# Altium project PCB-MAIN.PrjPcb (part 3 of 3)

## Sheet PCB-MAIN_06_LORA.SchDoc
size 594 x 420 mm
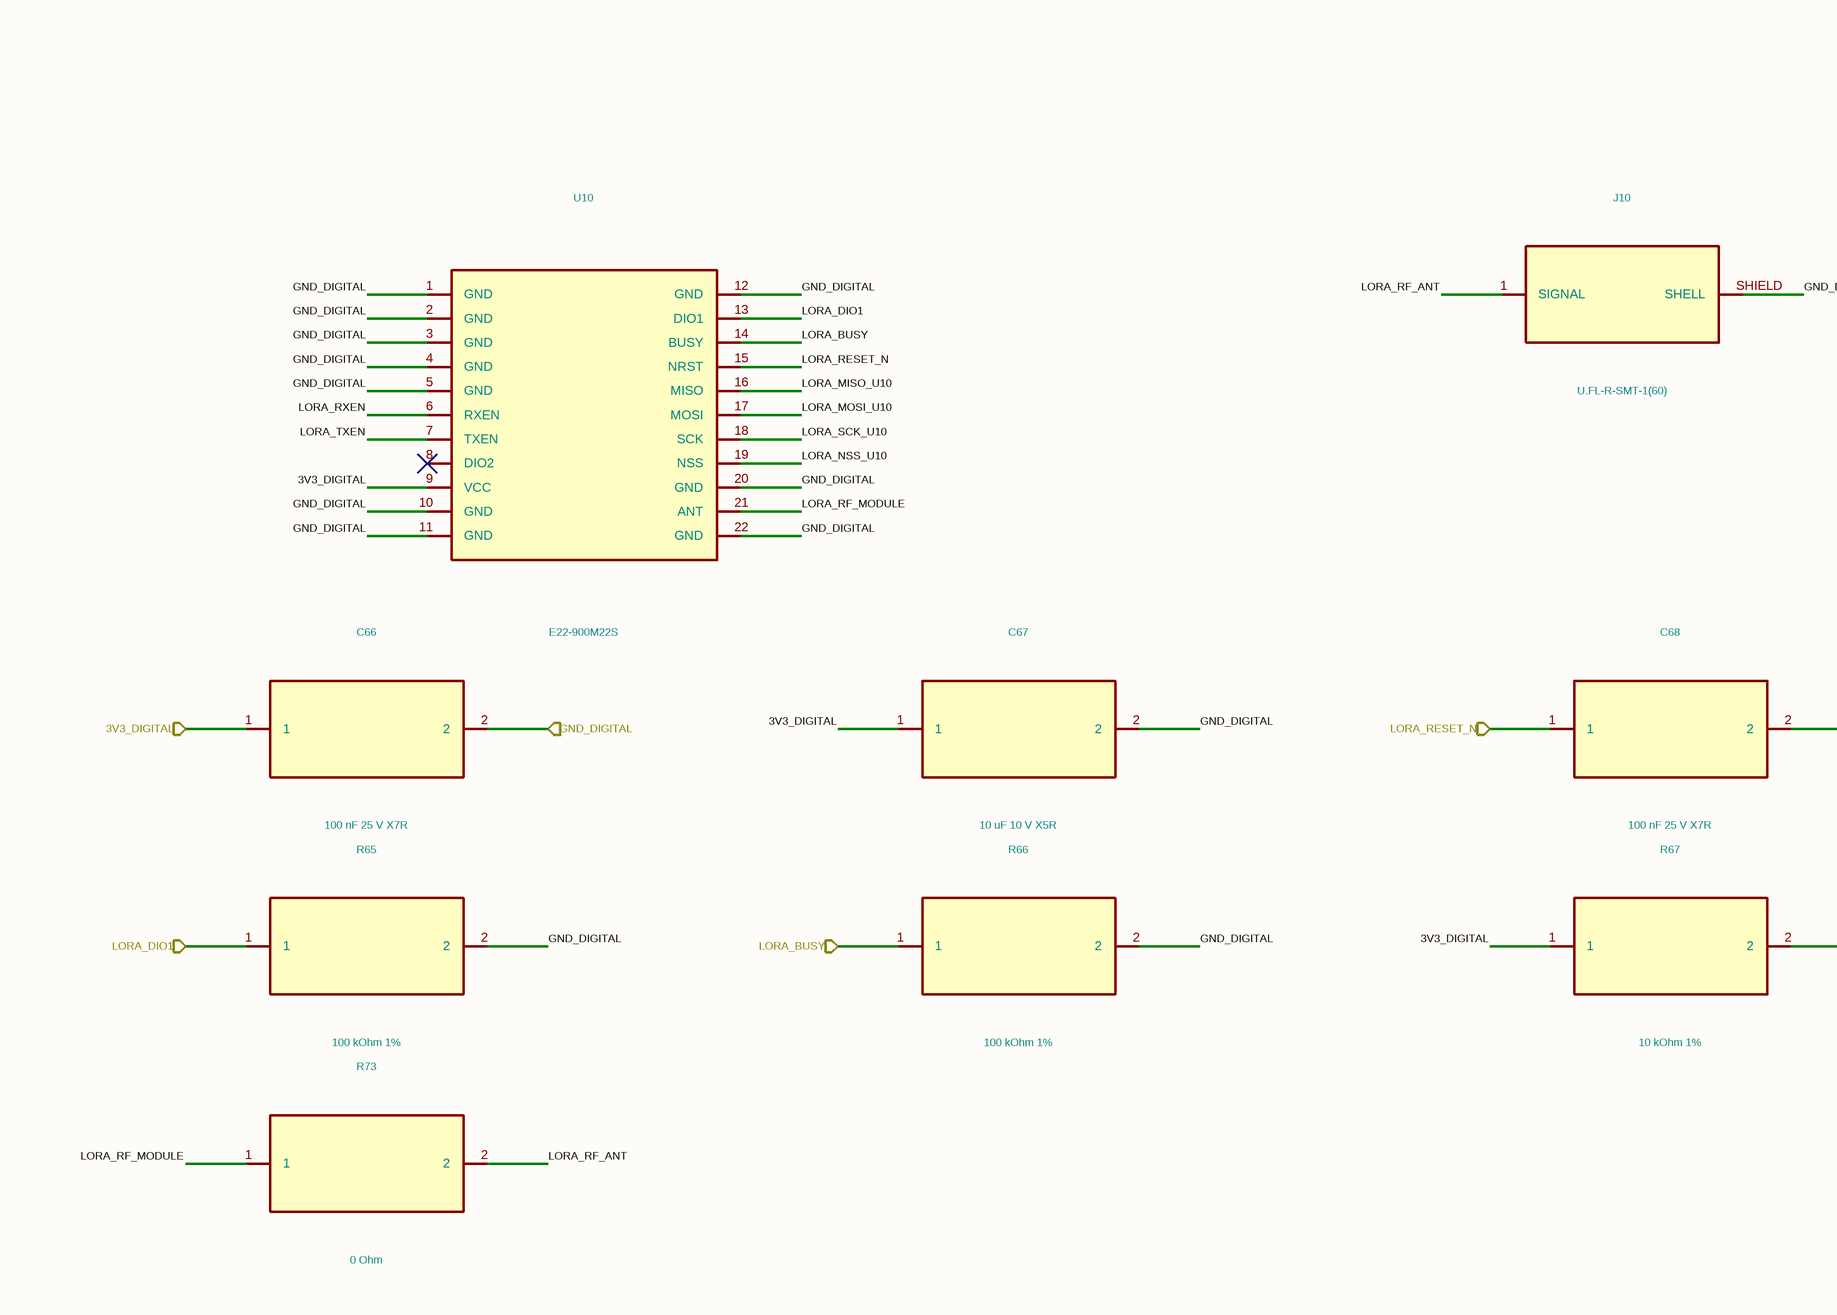
[diagram p41: PCB-MAIN_06_LORA.SchDoc, top left]
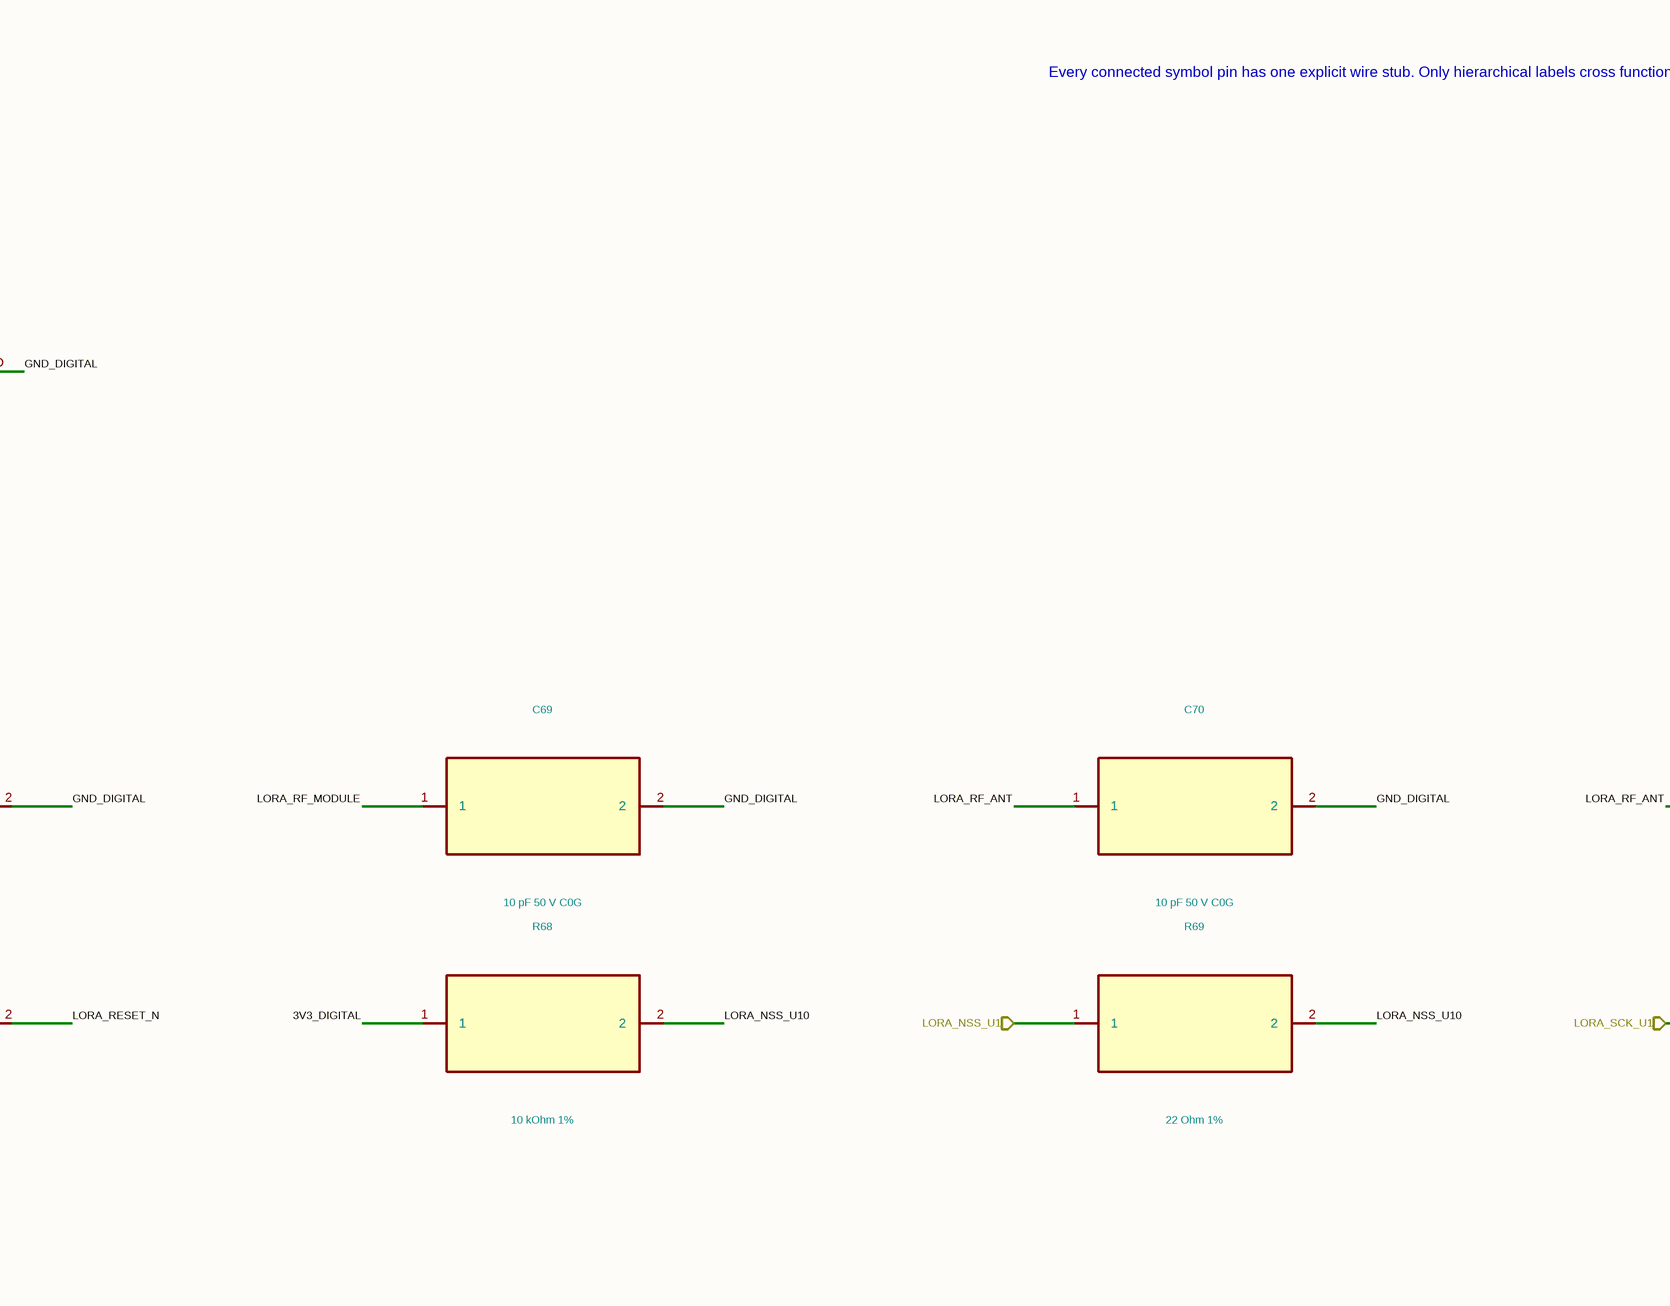
[diagram p42: PCB-MAIN_06_LORA.SchDoc, top middle]
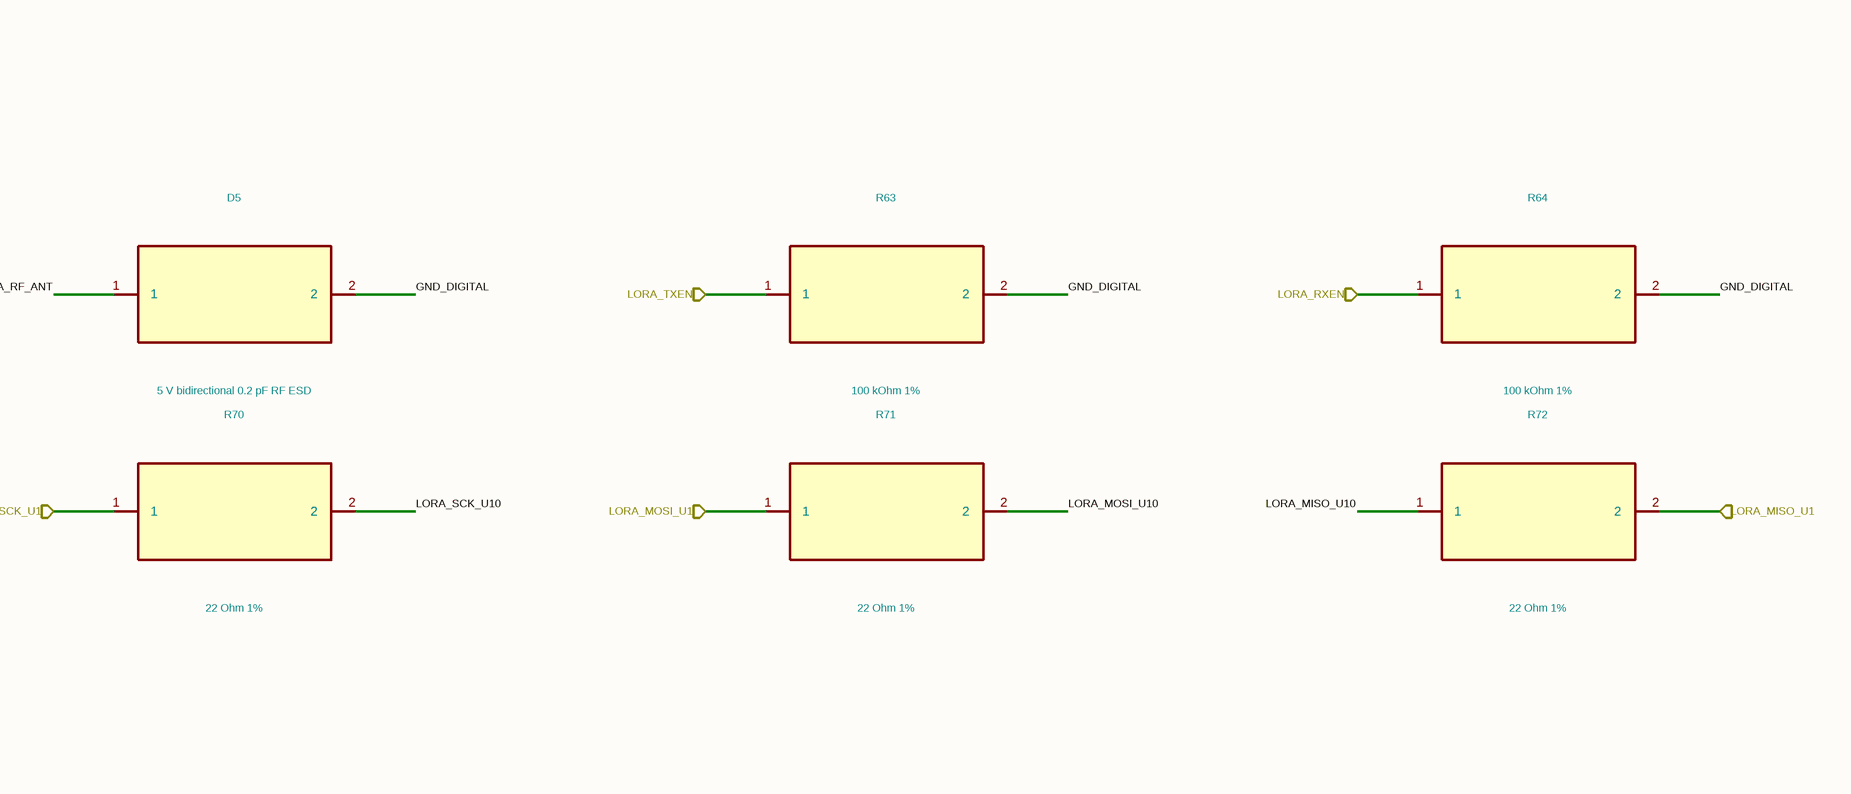
[diagram p43: PCB-MAIN_06_LORA.SchDoc, top right]
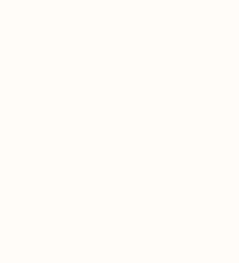
[diagram p44: PCB-MAIN_06_LORA.SchDoc, bottom left]

### Parts
C66  100 nF 25 V X7R  [C_0402_1005Metric]
C67  10 uF 10 V X5R  [C_0603_1608Metric]
C68  100 nF 25 V X7R  [C_0402_1005Metric]
C69  10 pF 50 V C0G  [C_0402_1005Metric]
C70  10 pF 50 V C0G  [C_0402_1005Metric]
D5  5 V bidirectional 0.2 pF RF ESD
J10  U.FL-R-SMT-1(60)
R63  100 kOhm 1%  [R_0402_1005Metric]
R64  100 kOhm 1%  [R_0402_1005Metric]
R65  100 kOhm 1%  [R_0402_1005Metric]
R66  100 kOhm 1%  [R_0402_1005Metric]
R67  10 kOhm 1%  [R_0402_1005Metric]
R68  10 kOhm 1%  [R_0402_1005Metric]
R69  22 Ohm 1%  [R_0402_1005Metric]
R70  22 Ohm 1%  [R_0402_1005Metric]
R71  22 Ohm 1%  [R_0402_1005Metric]
R72  22 Ohm 1%  [R_0402_1005Metric]
R73  0 Ohm  [R_0402_1005Metric]
U10  E22-900M22S

### Ports
3V3_DIGITAL, GND_DIGITAL, LORA_BUSY, LORA_DIO1, LORA_MISO_U1, LORA_MOSI_U1, LORA_NSS_U1, LORA_RESET_N, LORA_RXEN, LORA_SCK_U1, LORA_TXEN

### Nets
3V3_DIGITAL: C66.1 ; port 3V3_DIGITAL
3V3_DIGITAL: C67.1 R67.1 R68.1 U10.9(VCC)  [a separate net that carries the same name]
GND_DIGITAL: C66.2 ; port GND_DIGITAL
GND_DIGITAL: C67.2 C68.2 C69.2 C70.2 D5.2 J10.SHIELD(SHELL) R63.2 R64.2 R65.2 R66.2 U10.1(GND) U10.2(GND) U10.3(GND) U10.4(GND) U10.5(GND) U10.10(GND) U10.11(GND) U10.12(GND) U10.20(GND) U10.22(GND)  [a separate net that carries the same name]
LORA_BUSY: R66.1 ; port LORA_BUSY
LORA_BUSY: U10.14(BUSY)  [a separate net that carries the same name]
LORA_DIO1: R65.1 ; port LORA_DIO1
LORA_DIO1: U10.13(DIO1)  [a separate net that carries the same name]
LORA_MISO_U1: R72.2 ; port LORA_MISO_U1
LORA_MISO_U10: R72.1 U10.16(MISO)
LORA_MOSI_U1: R71.1 ; port LORA_MOSI_U1
LORA_MOSI_U10: R71.2 U10.17(MOSI)
LORA_NSS_U1: R69.1 ; port LORA_NSS_U1
LORA_NSS_U10: R68.2 R69.2 U10.19(NSS)
LORA_RESET_N: C68.1 ; port LORA_RESET_N
LORA_RESET_N: R67.2 U10.15(NRST)  [a separate net that carries the same name]
LORA_RF_ANT: C70.1 D5.1 J10.1(SIGNAL) R73.2
LORA_RF_MODULE: C69.1 R73.1 U10.21(ANT)
LORA_RXEN: R64.1 ; port LORA_RXEN
LORA_RXEN: U10.6(RXEN)  [a separate net that carries the same name]
LORA_SCK_U1: R70.1 ; port LORA_SCK_U1
LORA_SCK_U10: R70.2 U10.18(SCK)
LORA_TXEN: R63.1 ; port LORA_TXEN
LORA_TXEN: U10.7(TXEN)  [a separate net that carries the same name]

Not connected (* = marked no-connect by the designer): U10 8(DIO2)*

### Notes on the sheet
- Every connected symbol pin has one explicit wire stub. Only hierarchical labels cross functional-sheet boundaries.
- 1
- 2
- 3
- 4
- 5
- 6
- 7
- 8
- 9
- 10
- 11
- A
- B
- C
- D
- E
- F
- G
- H
- Human-readable hierarchy candidate; exact Review-A pin/net equivalence enforced
- Functional sheet 7 of 10
- NOT FOR MANUFACTURE - hierarchy review/routing/DRC/DFM/Review B pending
- Title: Dioneya PCB-MAIN Rev.A - LoRa
- File: PCB-MAIN_06_LORA.kicad_sch
- Sheet: /
- Dioneya / ZS-BPLA
- KiCad E.D.A.  kicad (5.1.4)-1
- Size: A2
- Date: 2026-09-16
- Rev: A
- Id: 1/1

### Library data of the parts
C66 = C66_GRM155R71E104KE14D: Manufacturer: Murata; Population: FITTED; Authority: Ebyte_E22-M_v1.2; MPN: GRM155R71E104KE14D; Package: 0402; Value: 100 nF 25 V X7R; Footprint: Capacitor_SMD:C_0402_1005Metric
C67 = C67_GRM188R61A106KE69D: Manufacturer: Murata; Population: FITTED; Authority: Ebyte_E22-M_v1.2; MPN: GRM188R61A106KE69D; Package: 0603; Value: 10 uF 10 V X5R; Footprint: Capacitor_SMD:C_0603_1608Metric
C68 = C68_GRM155R71E104KE14D: Manufacturer: Murata; Population: FITTED; Authority: Ebyte_E22-M_v1.2; MPN: GRM155R71E104KE14D; Package: 0402; Value: 100 nF 25 V X7R; Footprint: Capacitor_SMD:C_0402_1005Metric
C69 = C69_GRM1555C1H100JA01D: Manufacturer: Murata; Population: DNP; Authority: Ebyte_E22-M_v1.2; MPN: GRM1555C1H100JA01D; Package: 0402; Value: 10 pF 50 V C0G; Footprint: Capacitor_SMD:C_0402_1005Metric
C70 = C70_GRM1555C1H100JA01D: Manufacturer: Murata; Population: DNP; Authority: Ebyte_E22-M_v1.2; MPN: GRM1555C1H100JA01D; Package: 0402; Value: 10 pF 50 V C0G; Footprint: Capacitor_SMD:C_0402_1005Metric
D5 = D5_PESD5V0C1BSF: Manufacturer: Nexperia; Population: FITTED; Authority: Nexperia_PESD5V0C1BSF_v3; MPN: PESD5V0C1BSF; Package: SOD962-2; Value: 5 V bidirectional 0.2 pF RF ESD
J10 = J10_U.FL-R-SMT-1_60: Manufacturer: CONTROLLED_AUTHORITY; Population: FITTED; Authority: PCB_MAIN_LORA_PIN_AUTHORITY_REV_A.csv;PCB_MAIN_CONNECTOR_FIXTURE_PIN_AUTHORITY_REV_A.csv; MPN: U.FL-R-SMT-1(60); Package: U.FL_SMT; Value: U.FL-R-SMT-1(60)
R63 = R63_ERJ-2RKF1003X: Manufacturer: Panasonic; Population: FITTED; Authority: Ebyte_E22-M_v1.2; MPN: ERJ-2RKF1003X; Package: 0402; Value: 100 kOhm 1%; Footprint: Resistor_SMD:R_0402_1005Metric
R64 = R64_ERJ-2RKF1003X: Manufacturer: Panasonic; Population: FITTED; Authority: Ebyte_E22-M_v1.2; MPN: ERJ-2RKF1003X; Package: 0402; Value: 100 kOhm 1%; Footprint: Resistor_SMD:R_0402_1005Metric
R65 = R65_ERJ-2RKF1003X: Manufacturer: Panasonic; Population: FITTED; Authority: Ebyte_E22-M_v1.2; MPN: ERJ-2RKF1003X; Package: 0402; Value: 100 kOhm 1%; Footprint: Resistor_SMD:R_0402_1005Metric
R66 = R66_ERJ-2RKF1003X: Manufacturer: Panasonic; Population: FITTED; Authority: Ebyte_E22-M_v1.2; MPN: ERJ-2RKF1003X; Package: 0402; Value: 100 kOhm 1%; Footprint: Resistor_SMD:R_0402_1005Metric
R67 = R67_ERJ-2RKF1002X: Manufacturer: Panasonic; Population: FITTED; Authority: Ebyte_E22-M_v1.2; MPN: ERJ-2RKF1002X; Package: 0402; Value: 10 kOhm 1%; Footprint: Resistor_SMD:R_0402_1005Metric
R68 = R68_ERJ-2RKF1002X: Manufacturer: Panasonic; Population: FITTED; Authority: Ebyte_E22-M_v1.2; MPN: ERJ-2RKF1002X; Package: 0402; Value: 10 kOhm 1%; Footprint: Resistor_SMD:R_0402_1005Metric
R69 = R69_ERJ-2RKF22R0X: Manufacturer: Panasonic; Population: FITTED; Authority: Ebyte_E22-M_v1.2; MPN: ERJ-2RKF22R0X; Package: 0402; Value: 22 Ohm 1%; Footprint: Resistor_SMD:R_0402_1005Metric
R70 = R70_ERJ-2RKF22R0X: Manufacturer: Panasonic; Population: FITTED; Authority: Ebyte_E22-M_v1.2; MPN: ERJ-2RKF22R0X; Package: 0402; Value: 22 Ohm 1%; Footprint: Resistor_SMD:R_0402_1005Metric
R71 = R71_ERJ-2RKF22R0X: Manufacturer: Panasonic; Population: FITTED; Authority: Ebyte_E22-M_v1.2; MPN: ERJ-2RKF22R0X; Package: 0402; Value: 22 Ohm 1%; Footprint: Resistor_SMD:R_0402_1005Metric
R72 = R72_ERJ-2RKF22R0X: Manufacturer: Panasonic; Population: FITTED; Authority: Ebyte_E22-M_v1.2; MPN: ERJ-2RKF22R0X; Package: 0402; Value: 22 Ohm 1%; Footprint: Resistor_SMD:R_0402_1005Metric
R73 = R73_ERJ-2GE0R00X: Manufacturer: Panasonic; Population: FITTED; Authority: Ebyte_E22-M_v1.2; MPN: ERJ-2GE0R00X; Package: 0402; Value: 0 Ohm; Footprint: Resistor_SMD:R_0402_1005Metric
U10 = U10_E22-900M22S: Manufacturer: Ebyte; Population: FITTED; Authority: PCB_MAIN_LORA_PIN_AUTHORITY_REV_A.csv; MPN: E22-900M22S; Package: SMD_20x14_22P_1.27mm; Value: E22-900M22S

## Sheet PCB-MAIN_07_BLE.SchDoc
size 594 x 420 mm
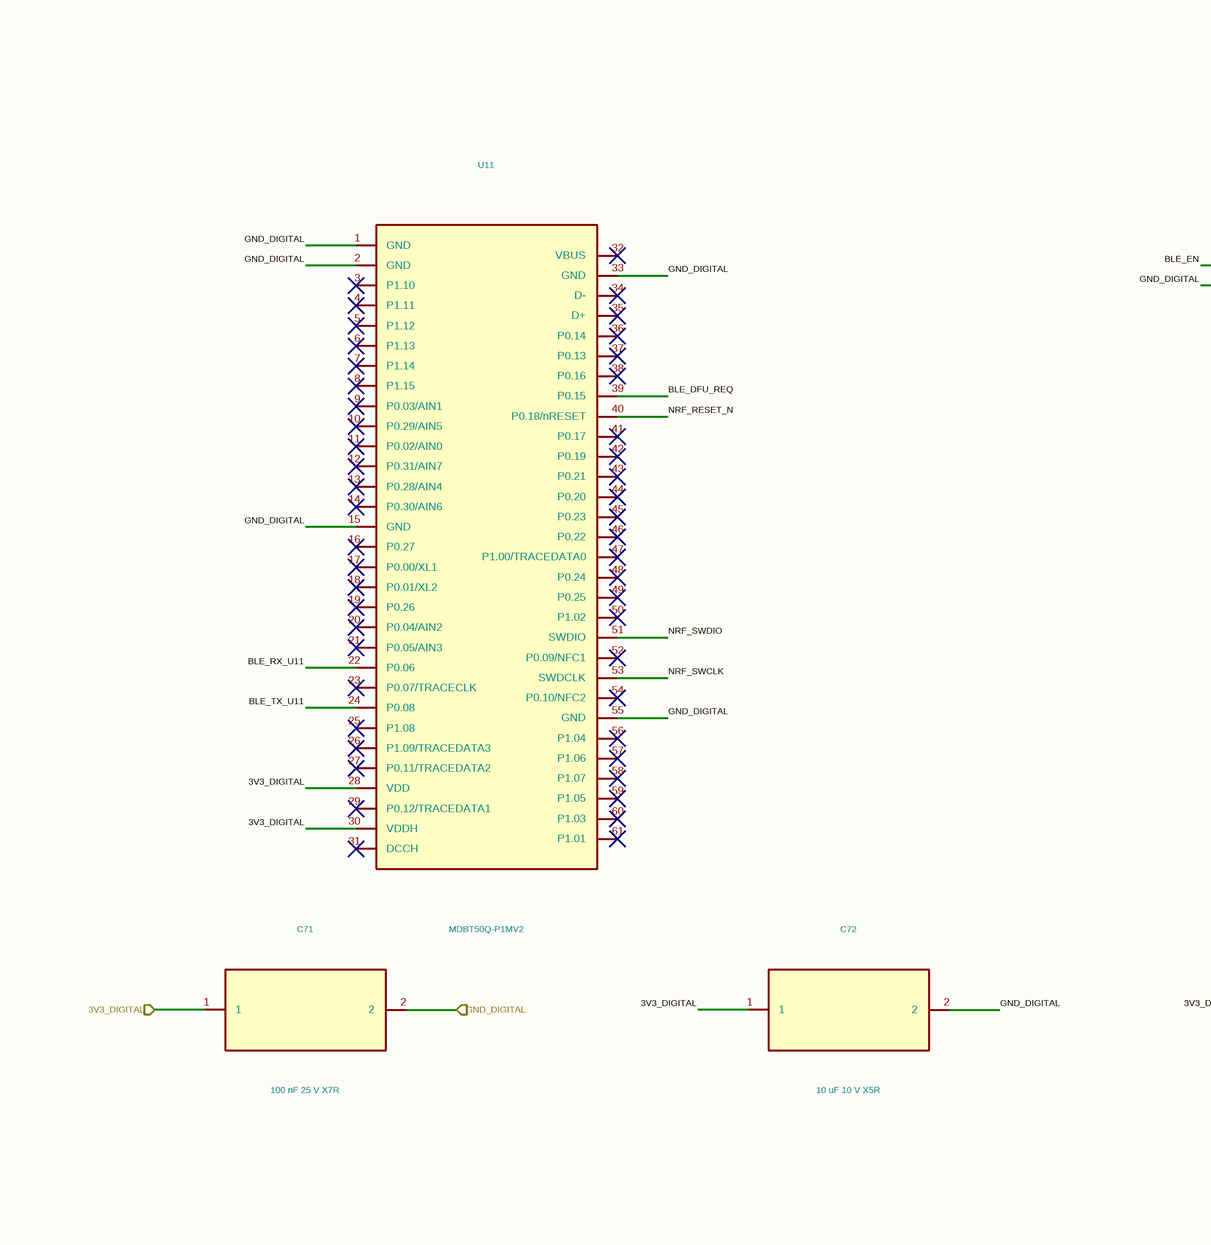
[diagram p45: PCB-MAIN_07_BLE.SchDoc, top left]
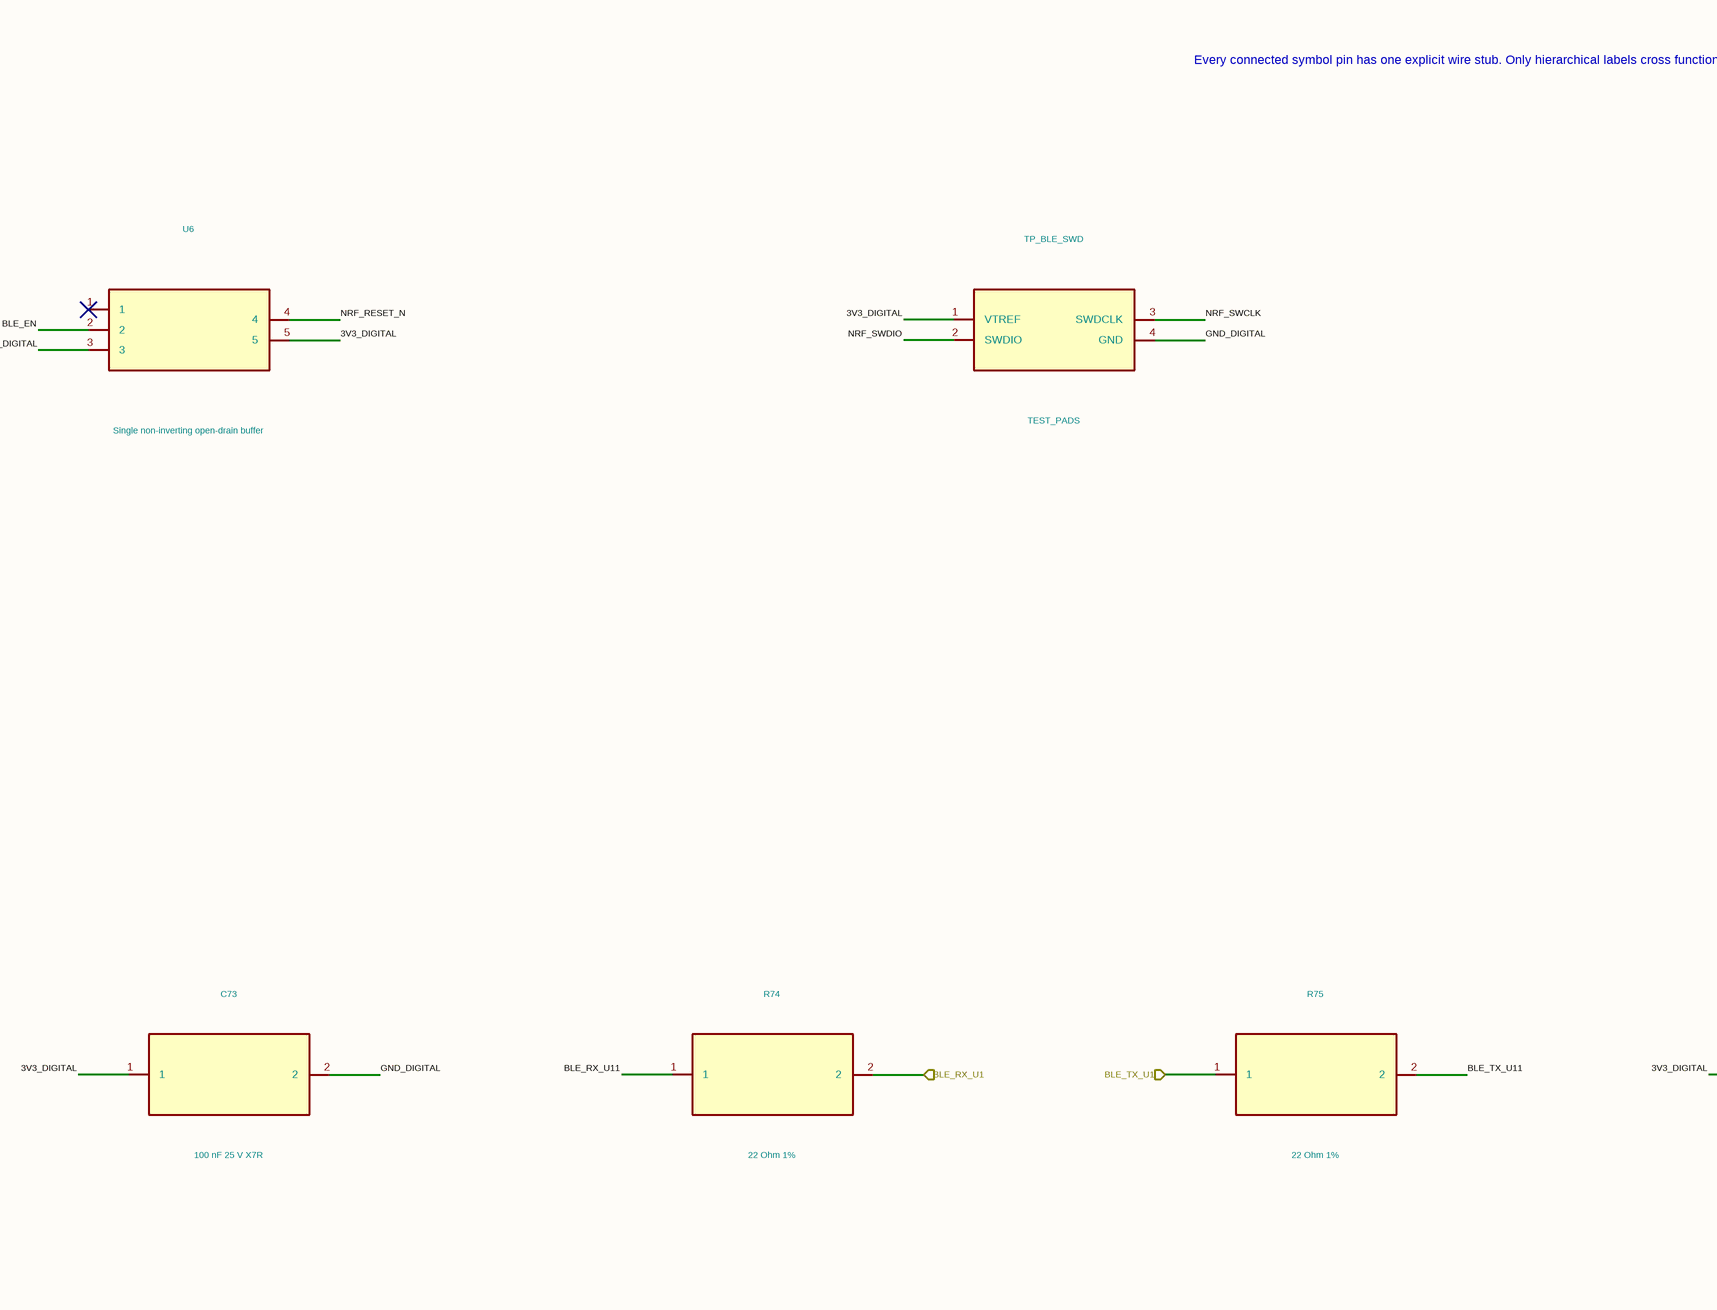
[diagram p46: PCB-MAIN_07_BLE.SchDoc, top middle]
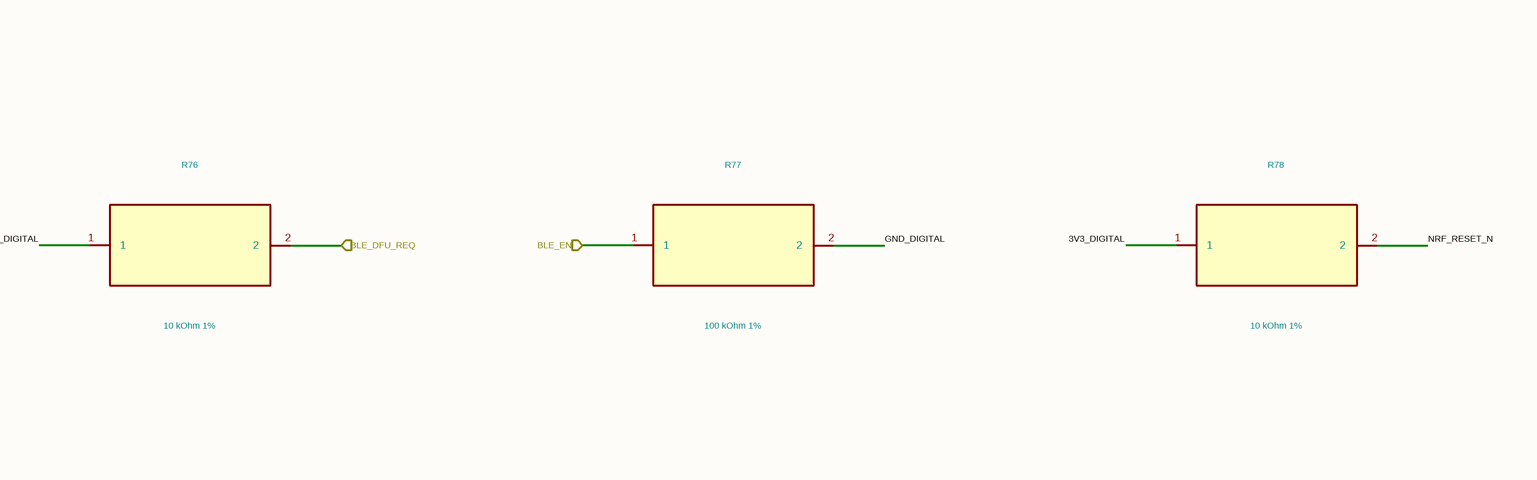
[diagram p47: PCB-MAIN_07_BLE.SchDoc, top right]
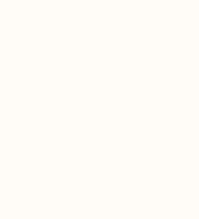
[diagram p48: PCB-MAIN_07_BLE.SchDoc, bottom left]

### Parts
C71  100 nF 25 V X7R  [C_0402_1005Metric]
C72  10 uF 10 V X5R  [C_0603_1608Metric]
C73  100 nF 25 V X7R  [C_0402_1005Metric]
R74  22 Ohm 1%  [R_0402_1005Metric]
R75  22 Ohm 1%  [R_0402_1005Metric]
R76  10 kOhm 1%  [R_0402_1005Metric]
R77  100 kOhm 1%  [R_0402_1005Metric]
R78  10 kOhm 1%  [R_0402_1005Metric]
TP_BLE_SWD  TEST_PADS
U6  Single non-inverting open-drain buffer
U11  MDBT50Q-P1MV2

### Ports
3V3_DIGITAL, BLE_DFU_REQ, BLE_EN, BLE_RX_U1, BLE_TX_U1, GND_DIGITAL

### Nets
3V3_DIGITAL: C71.1 ; port 3V3_DIGITAL
3V3_DIGITAL: C72.1 C73.1 R76.1 R78.1 TP_BLE_SWD.1(VTREF) U6.5 U11.28(VDD) U11.30(VDDH)  [a separate net that carries the same name]
BLE_DFU_REQ: R76.2 ; port BLE_DFU_REQ
BLE_DFU_REQ: U11.39(P0.15)  [a separate net that carries the same name]
BLE_EN: R77.1 ; port BLE_EN
BLE_EN: U6.2  [a separate net that carries the same name]
BLE_RX_U1: R74.2 ; port BLE_RX_U1
BLE_RX_U11: R74.1 U11.22(P0.06)
BLE_TX_U1: R75.1 ; port BLE_TX_U1
BLE_TX_U11: R75.2 U11.24(P0.08)
GND_DIGITAL: C71.2 ; port GND_DIGITAL
GND_DIGITAL: C72.2 C73.2 R77.2 TP_BLE_SWD.4(GND) U6.3 U11.1(GND) U11.2(GND) U11.15(GND) U11.33(GND) U11.55(GND)  [a separate net that carries the same name]
NRF_RESET_N: R78.2 U6.4 U11.40(P0.18/nRESET)
NRF_SWCLK: TP_BLE_SWD.3(SWDCLK) U11.53(SWDCLK)
NRF_SWDIO: TP_BLE_SWD.2(SWDIO) U11.51(SWDIO)

Not connected (* = marked no-connect by the designer): U6 1*; U11 3(P1.10)* 4(P1.11)* 5(P1.12)* 6(P1.13)* 7(P1.14)* 8(P1.15)* 9(P0.03/AIN1)* 10(P0.29/AIN5)* 11(P0.02/AIN0)* 12(P0.31/AIN7)* 13(P0.28/AIN4)* 14(P0.30/AIN6)* 16(P0.27)* 17(P0.00/XL1)* 18(P0.01/XL2)* 19(P0.26)* 20(P0.04/AIN2)* 21(P0.05/AIN3)* 23(P0.07/TRACECLK)* 25(P1.08)* 26(P1.09/TRACEDATA3)* 27(P0.11/TRACEDATA2)* 29(P0.12/TRACEDATA1)* 31(DCCH)* 32(VBUS)* 34(D-)* 35(D+)* 36(P0.14)* 37(P0.13)* 38(P0.16)* 41(P0.17)* 42(P0.19)* 43(P0.21)* 44(P0.20)* 45(P0.23)* 46(P0.22)* 47(P1.00/TRACEDATA0)* 48(P0.24)* 49(P0.25)* 50(P1.02)* 52(P0.09/NFC1)* 54(P0.10/NFC2)* 56(P1.04)* 57(P1.06)* 58(P1.07)* 59(P1.05)* 60(P1.03)* 61(P1.01)*

### Notes on the sheet
- Every connected symbol pin has one explicit wire stub. Only hierarchical labels cross functional-sheet boundaries.
- 1
- 2
- 3
- 4
- 5
- 6
- 7
- 8
- 9
- 10
- 11
- A
- B
- C
- D
- E
- F
- G
- H
- Human-readable hierarchy candidate; exact Review-A pin/net equivalence enforced
- Functional sheet 8 of 10
- NOT FOR MANUFACTURE - hierarchy review/routing/DRC/DFM/Review B pending
- Title: Dioneya PCB-MAIN Rev.A - BLE
- File: PCB-MAIN_07_BLE.kicad_sch
- Sheet: /
- Dioneya / ZS-BPLA
- KiCad E.D.A.  kicad (5.1.4)-1
- Size: A2
- Date: 2026-09-16
- Rev: A
- Id: 1/1

### Library data of the parts
C71 = C71_GRM155R71E104KE14D: Manufacturer: Murata; Population: FITTED; Authority: Raytac_MDBT50Q_Spec_Version_L; MPN: GRM155R71E104KE14D; Package: 0402; Value: 100 nF 25 V X7R; Footprint: Capacitor_SMD:C_0402_1005Metric
C72 = C72_GRM188R61A106KE69D: Manufacturer: Murata; Population: FITTED; Authority: Raytac_MDBT50Q_Spec_Version_L; MPN: GRM188R61A106KE69D; Package: 0603; Value: 10 uF 10 V X5R; Footprint: Capacitor_SMD:C_0603_1608Metric
C73 = C73_GRM155R71E104KE14D: Manufacturer: Murata; Population: FITTED; Authority: TI_SN74LVC1G07_datasheet; MPN: GRM155R71E104KE14D; Package: 0402; Value: 100 nF 25 V X7R; Footprint: Capacitor_SMD:C_0402_1005Metric
R74 = R74_ERJ-2RKF22R0X: Manufacturer: Panasonic; Population: FITTED; Authority: Raytac_MDBT50Q_Spec_Version_L; MPN: ERJ-2RKF22R0X; Package: 0402; Value: 22 Ohm 1%; Footprint: Resistor_SMD:R_0402_1005Metric
R75 = R75_ERJ-2RKF22R0X: Manufacturer: Panasonic; Population: FITTED; Authority: Raytac_MDBT50Q_Spec_Version_L; MPN: ERJ-2RKF22R0X; Package: 0402; Value: 22 Ohm 1%; Footprint: Resistor_SMD:R_0402_1005Metric
R76 = R76_ERJ-2RKF1002X: Manufacturer: Panasonic; Population: FITTED; Authority: Raytac_MDBT50Q_Spec_Version_L; MPN: ERJ-2RKF1002X; Package: 0402; Value: 10 kOhm 1%; Footprint: Resistor_SMD:R_0402_1005Metric
R77 = R77_ERJ-2RKF1003X: Manufacturer: Panasonic; Population: FITTED; Authority: TI_SN74LVC1G07_datasheet; MPN: ERJ-2RKF1003X; Package: 0402; Value: 100 kOhm 1%; Footprint: Resistor_SMD:R_0402_1005Metric
R78 = R78_ERJ-2RKF1002X: Manufacturer: Panasonic; Population: FITTED; Authority: TI_SN74LVC1G07_datasheet; MPN: ERJ-2RKF1002X; Package: 0402; Value: 10 kOhm 1%; Footprint: Resistor_SMD:R_0402_1005Metric
TP_BLE_SWD = TP_BLE_SWD_TEST_PADS: Manufacturer: CONTROLLED_AUTHORITY; Population: FITTED; Authority: PCB_MAIN_BLE_PIN_AUTHORITY_REV_A.csv; MPN: TEST_PADS; Package: POGO_FIXTURE_4P; Value: TEST_PADS
U6 = U6_SN74LVC1G07DBVR: Manufacturer: Texas Instruments; Population: FITTED; Authority: TI_SN74LVC1G07_datasheet; MPN: SN74LVC1G07DBVR; Package: SOT-23-5_DBV; Value: Single non-inverting open-drain buffer
U11 = U11_MDBT50Q-P1MV2: Manufacturer: Raytac; Population: FITTED; Authority: PCB_MAIN_BLE_PIN_AUTHORITY_REV_A.csv; MPN: MDBT50Q-P1MV2; Package: nRF52840_SMD_10.5x15.5_61P_PCB_antenna; Value: MDBT50Q-P1MV2

## Sheet PCB-MAIN_08_STORAGE_SENSORS.SchDoc
size 594 x 420 mm
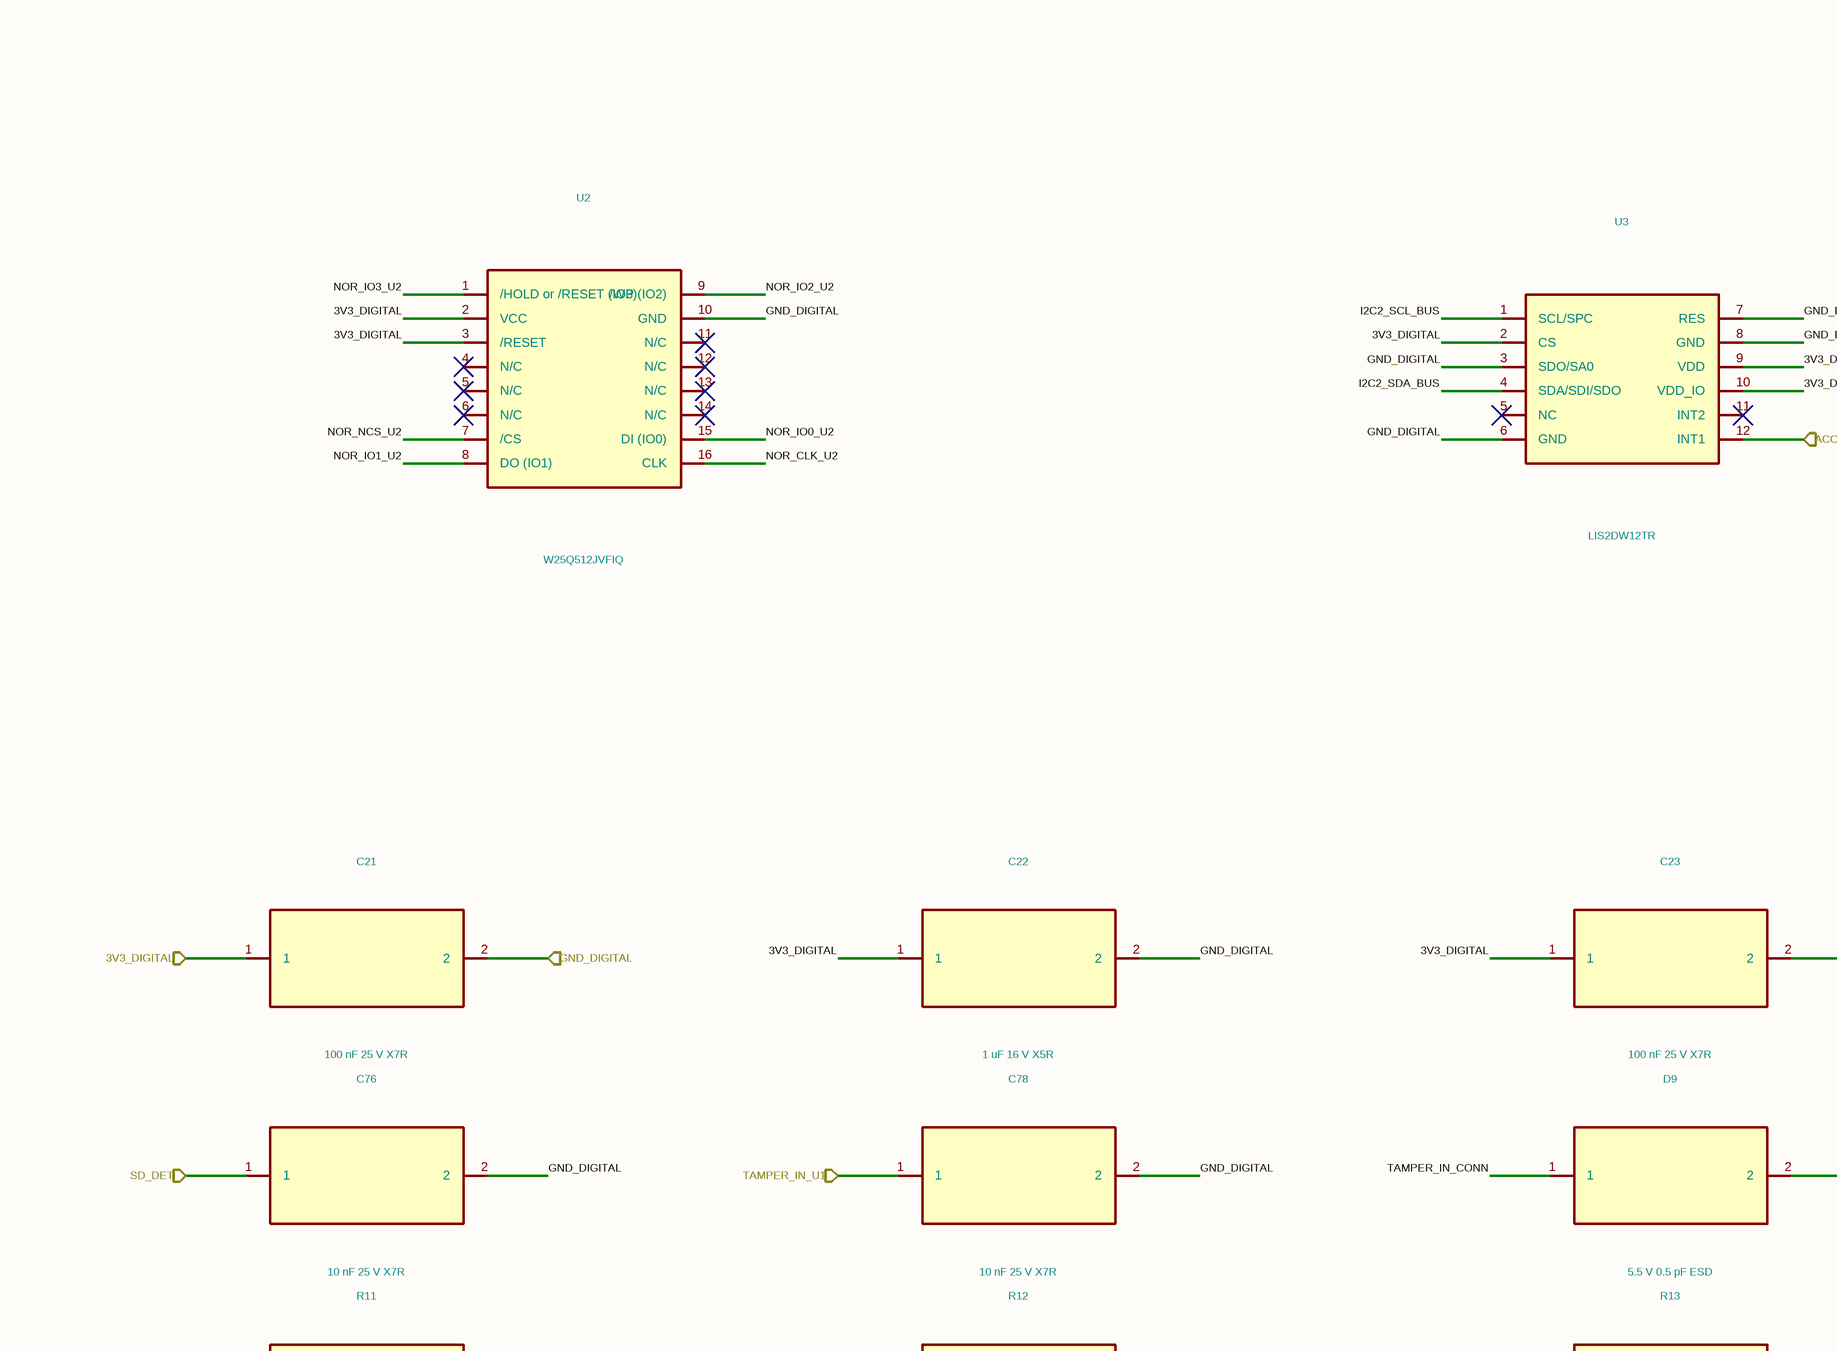
[diagram p49: PCB-MAIN_08_STORAGE_SENSORS.SchDoc, top left]
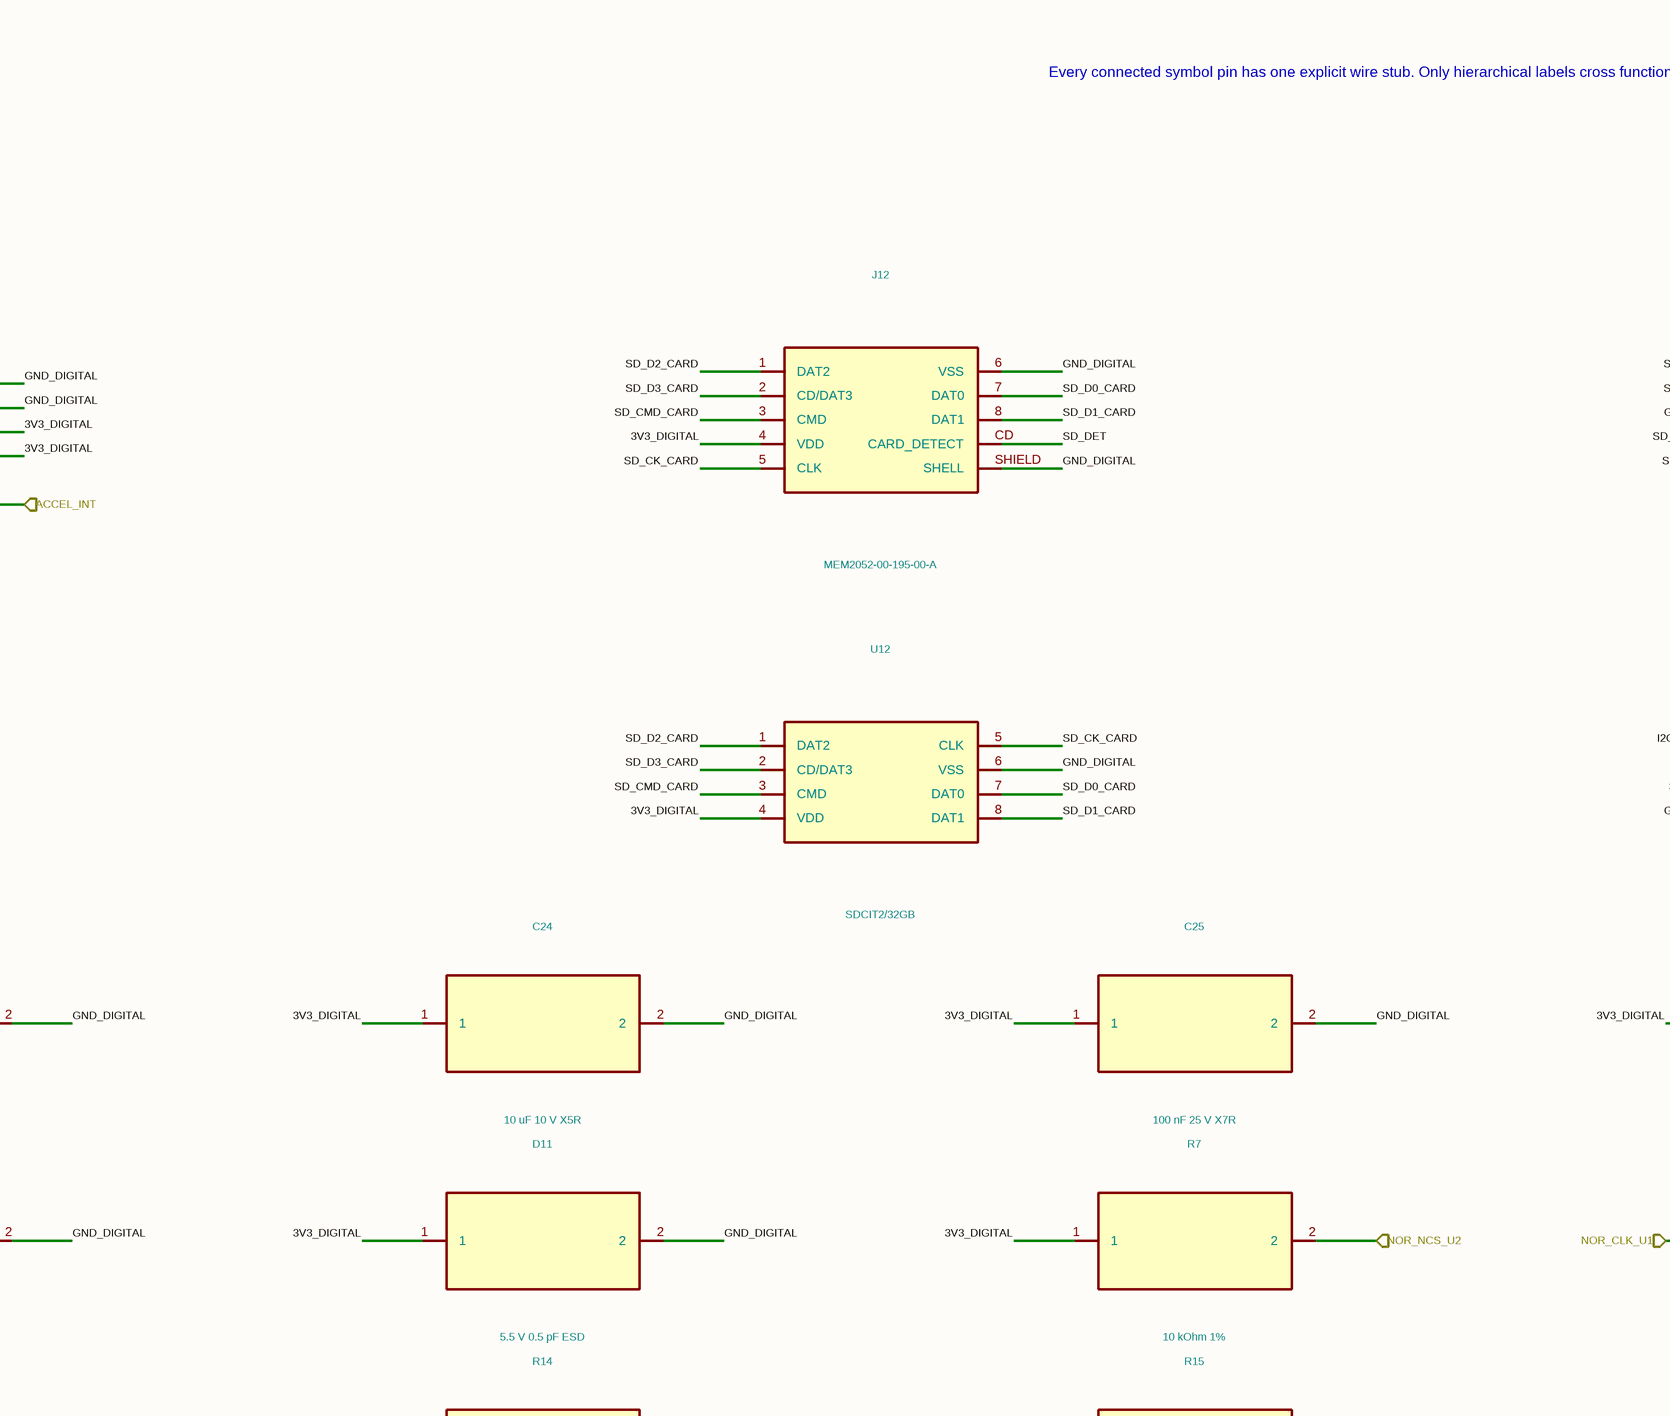
[diagram p50: PCB-MAIN_08_STORAGE_SENSORS.SchDoc, top middle]
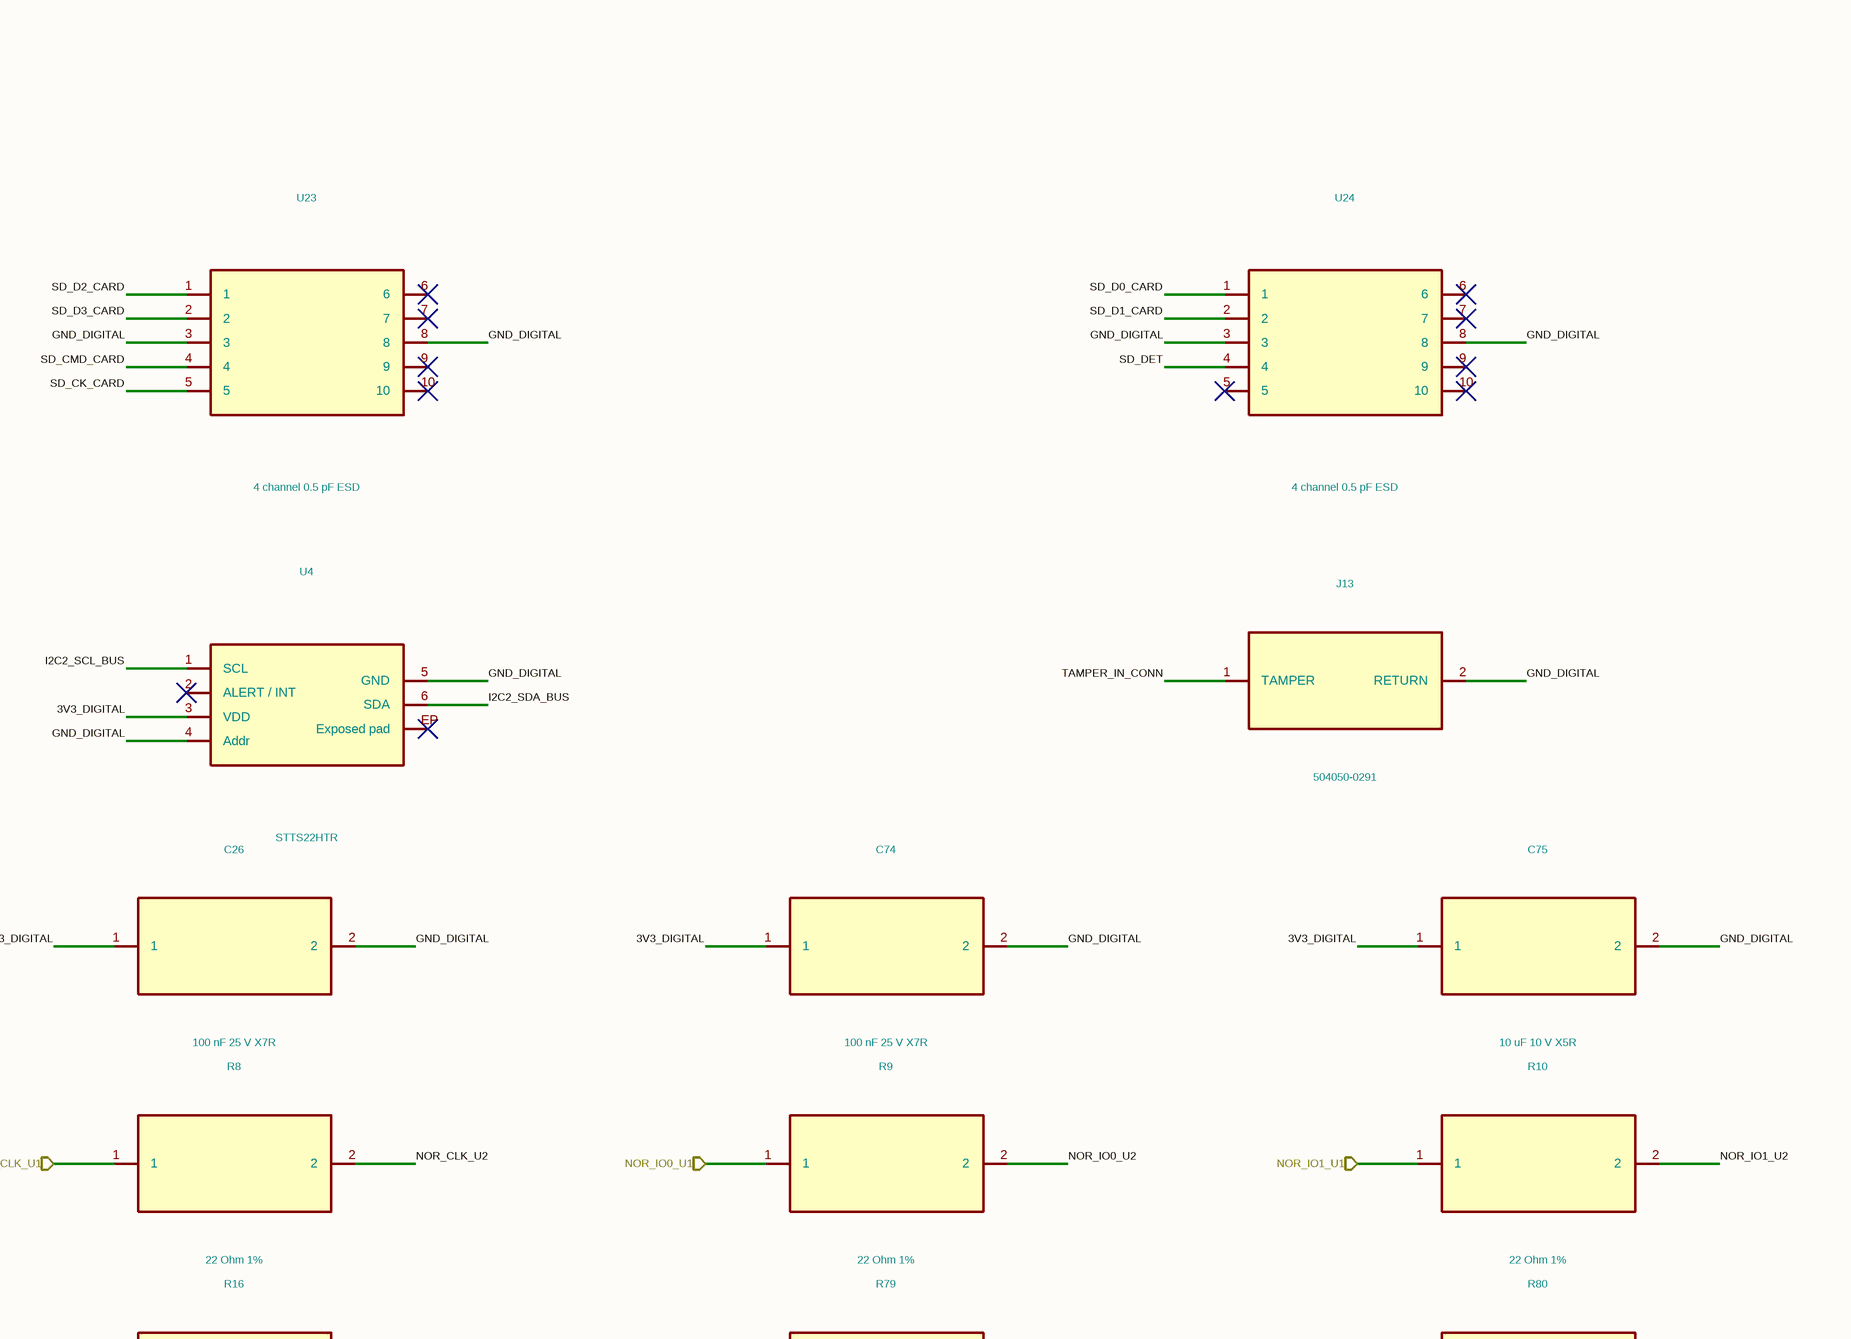
[diagram p51: PCB-MAIN_08_STORAGE_SENSORS.SchDoc, top right]
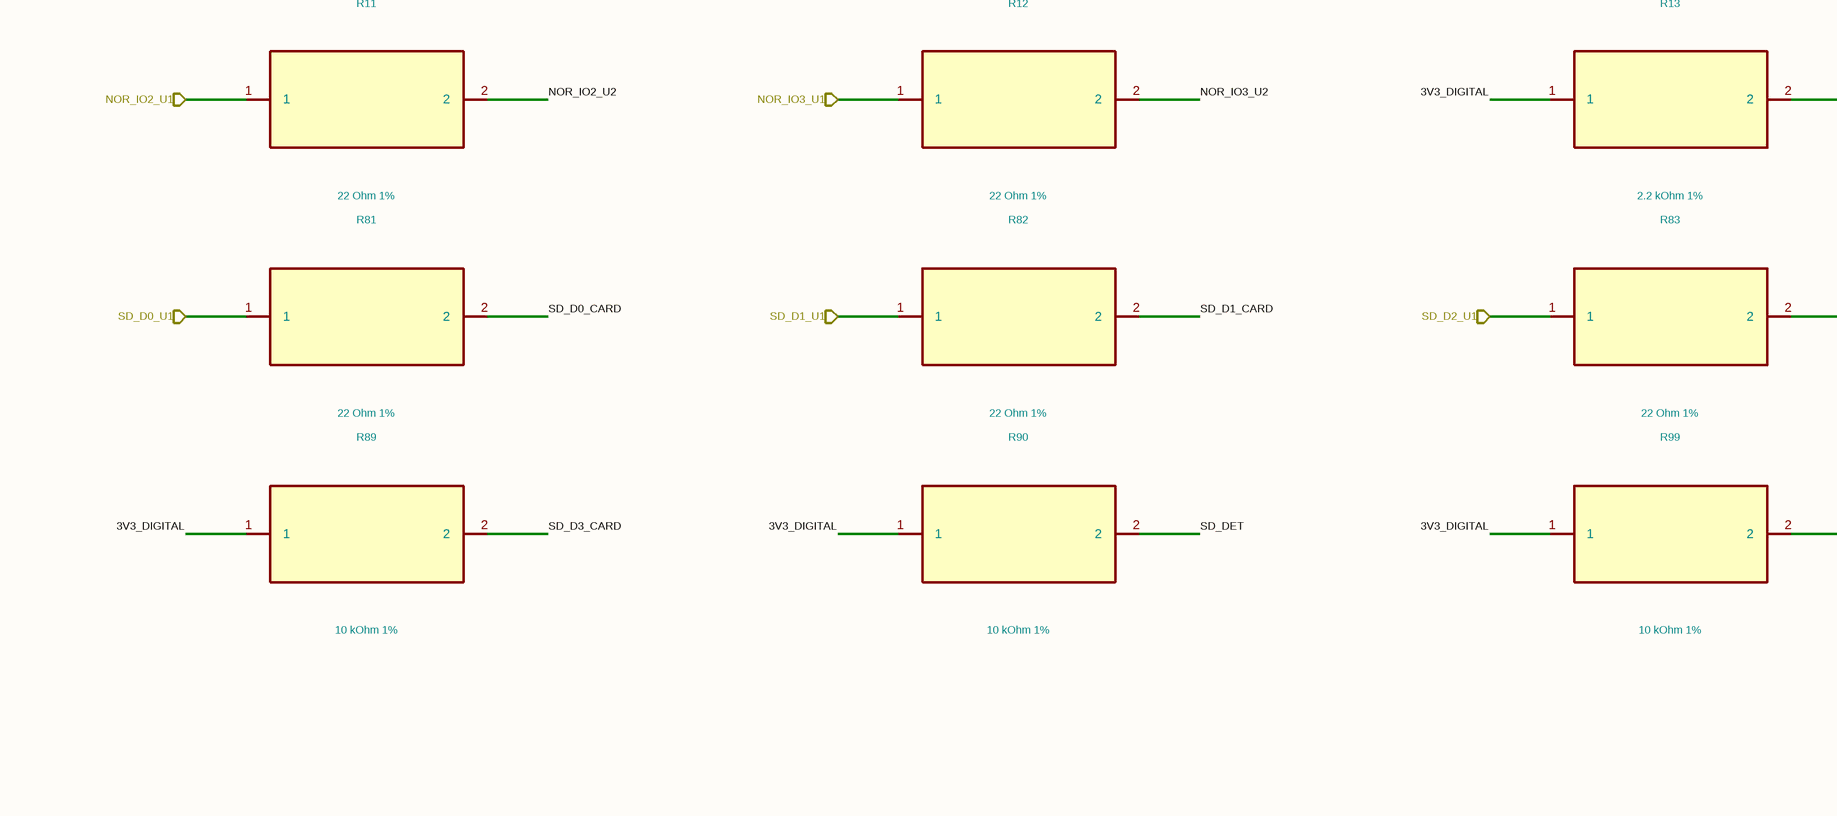
[diagram p52: PCB-MAIN_08_STORAGE_SENSORS.SchDoc, centre left]
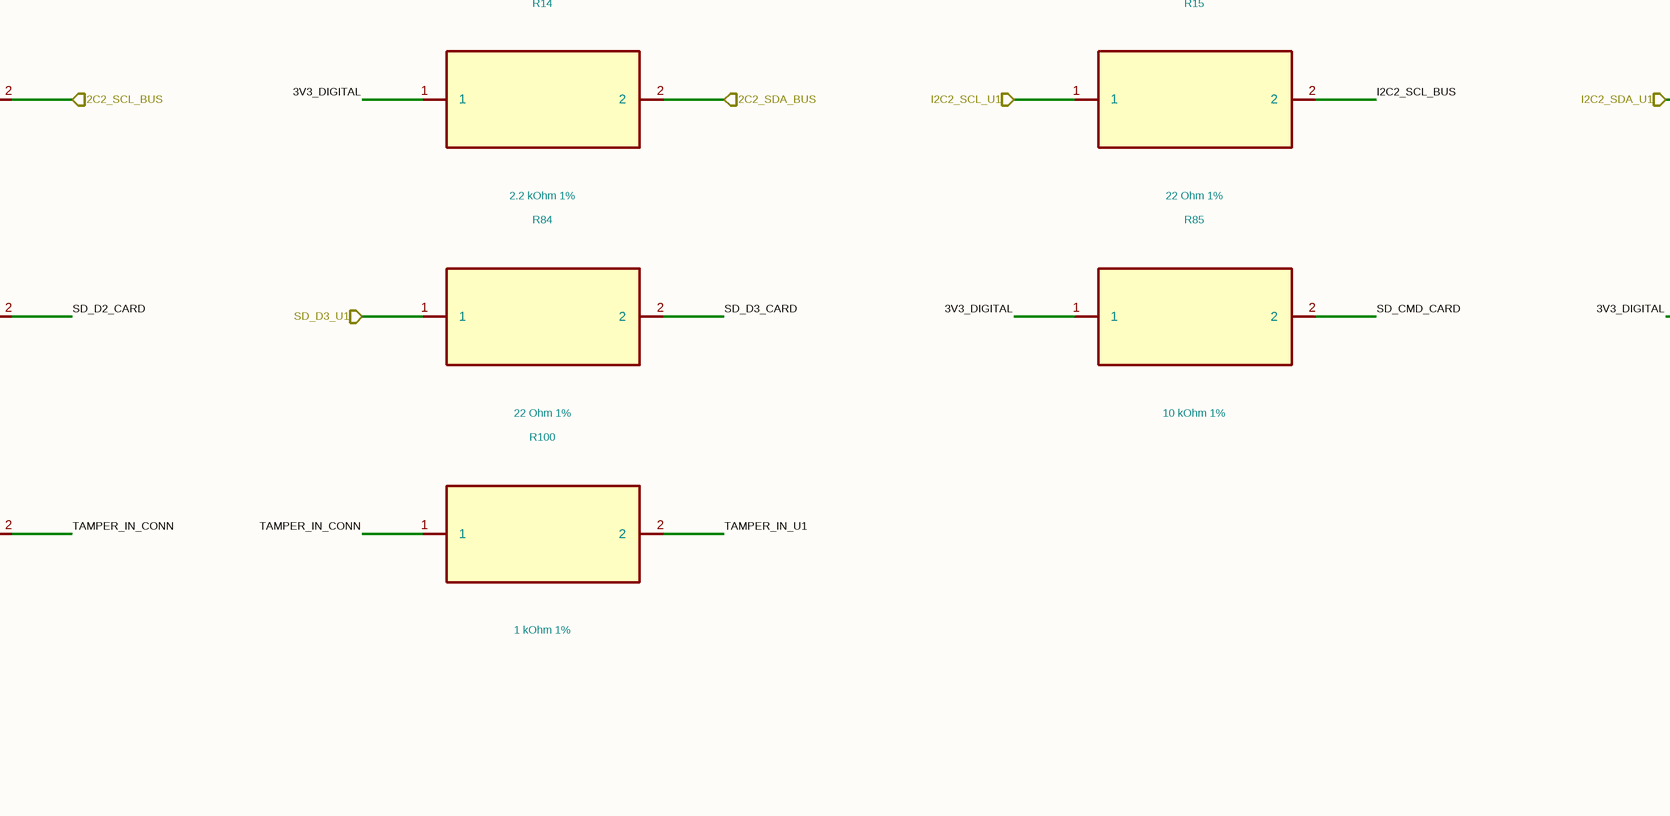
[diagram p53: PCB-MAIN_08_STORAGE_SENSORS.SchDoc, centre middle]
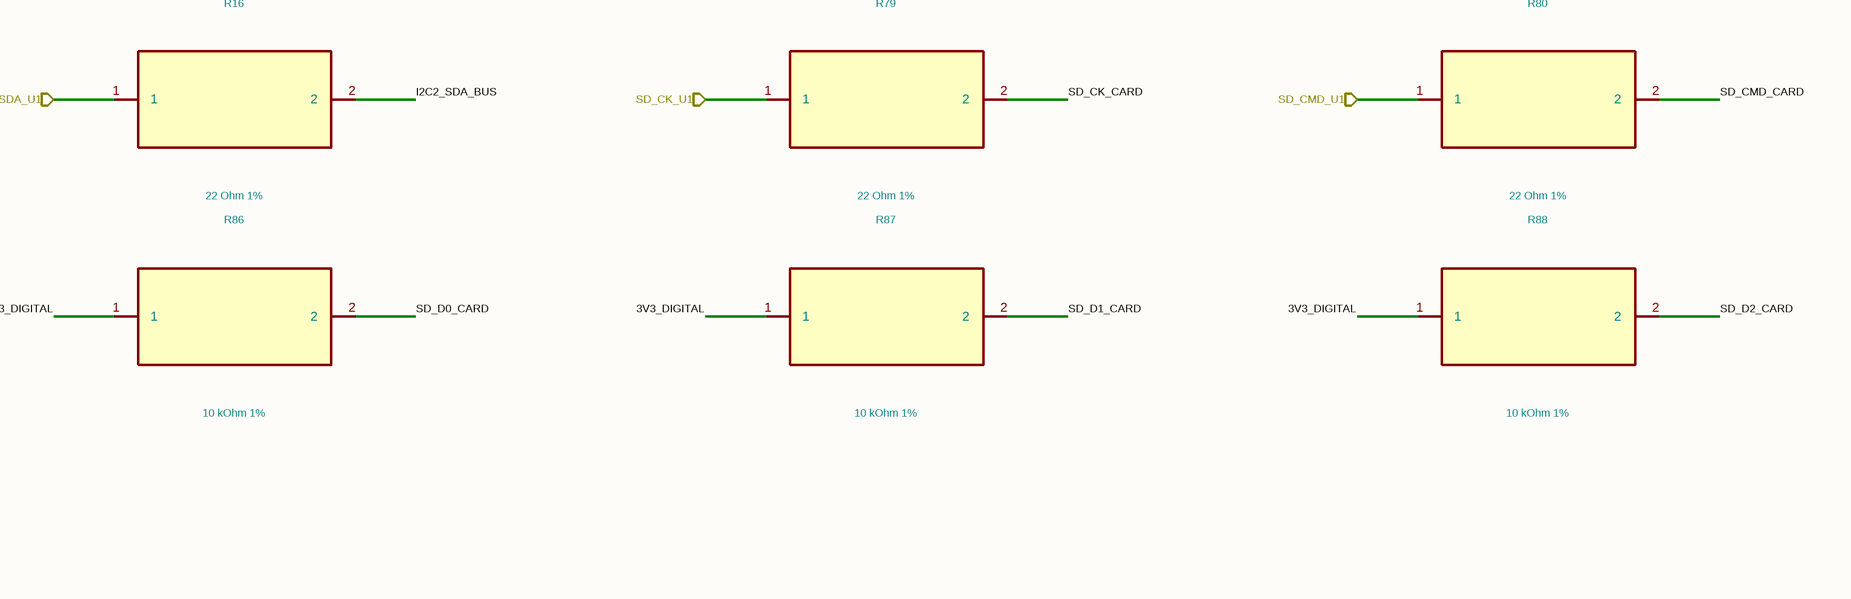
[diagram p54: PCB-MAIN_08_STORAGE_SENSORS.SchDoc, centre right]
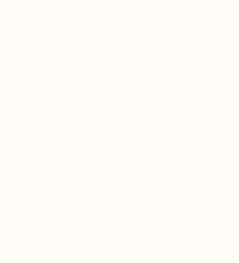
[diagram p55: PCB-MAIN_08_STORAGE_SENSORS.SchDoc, bottom left]

### Parts
C21  100 nF 25 V X7R  [C_0402_1005Metric]
C22  1 uF 16 V X5R  [C_0402_1005Metric]
C23  100 nF 25 V X7R  [C_0402_1005Metric]
C24  10 uF 10 V X5R  [C_0603_1608Metric]
C25  100 nF 25 V X7R  [C_0402_1005Metric]
C26  100 nF 25 V X7R  [C_0402_1005Metric]
C74  100 nF 25 V X7R  [C_0402_1005Metric]
C75  10 uF 10 V X5R  [C_0603_1608Metric]
C76  10 nF 25 V X7R  [C_0402_1005Metric]
C78  10 nF 25 V X7R  [C_0402_1005Metric]
D9  5.5 V 0.5 pF ESD
D11  5.5 V 0.5 pF ESD
J12  MEM2052-00-195-00-A
J13  504050-0291
R7  10 kOhm 1%  [R_0402_1005Metric]
R8  22 Ohm 1%  [R_0402_1005Metric]
R9  22 Ohm 1%  [R_0402_1005Metric]
R10  22 Ohm 1%  [R_0402_1005Metric]
R11  22 Ohm 1%  [R_0402_1005Metric]
R12  22 Ohm 1%  [R_0402_1005Metric]
R13  2.2 kOhm 1%  [R_0402_1005Metric]
R14  2.2 kOhm 1%  [R_0402_1005Metric]
R15  22 Ohm 1%  [R_0402_1005Metric]
R16  22 Ohm 1%  [R_0402_1005Metric]
R79  22 Ohm 1%  [R_0402_1005Metric]
R80  22 Ohm 1%  [R_0402_1005Metric]
R81  22 Ohm 1%  [R_0402_1005Metric]
R82  22 Ohm 1%  [R_0402_1005Metric]
R83  22 Ohm 1%  [R_0402_1005Metric]
R84  22 Ohm 1%  [R_0402_1005Metric]
R85  10 kOhm 1%  [R_0402_1005Metric]
R86  10 kOhm 1%  [R_0402_1005Metric]
R87  10 kOhm 1%  [R_0402_1005Metric]
R88  10 kOhm 1%  [R_0402_1005Metric]
R89  10 kOhm 1%  [R_0402_1005Metric]
R90  10 kOhm 1%  [R_0402_1005Metric]
R99  10 kOhm 1%  [R_0402_1005Metric]
R100  1 kOhm 1%  [R_0402_1005Metric]
U2  W25Q512JVFIQ
U3  LIS2DW12TR
U4  STTS22HTR
U12  SDCIT2/32GB
U23  4 channel 0.5 pF ESD
U24  4 channel 0.5 pF ESD

### Ports
3V3_DIGITAL, ACCEL_INT, GND_DIGITAL, I2C2_SCL_BUS, I2C2_SCL_U1, I2C2_SDA_BUS, I2C2_SDA_U1, NOR_CLK_U1, NOR_IO0_U1, NOR_IO1_U1, NOR_IO2_U1, NOR_IO3_U1, NOR_NCS_U2, SD_CK_U1, SD_CMD_U1, SD_D0_U1, SD_D1_U1, SD_D2_U1, SD_D3_U1, SD_DET, TAMPER_IN_U1

### Nets
3V3_DIGITAL: C21.1 ; port 3V3_DIGITAL
3V3_DIGITAL: C22.1 C23.1 C24.1 C25.1 C26.1 C74.1 C75.1 D11.1 J12.4(VDD) R7.1 R13.1 R14.1 R85.1 R86.1 R87.1 R88.1 R89.1 R90.1 R99.1 U2.2(VCC) U2.3(/RESET) U3.2(CS) U3.9(VDD) U3.10(VDD_IO) U4.3(VDD) U12.4(VDD)  [a separate net that carries the same name]
ACCEL_INT: U3.12(INT1) ; port ACCEL_INT
GND_DIGITAL: C21.2 ; port GND_DIGITAL
GND_DIGITAL: C22.2 C23.2 C24.2 C25.2 C26.2 C74.2 C75.2 C76.2 C78.2 D9.2 D11.2 J12.6(VSS) J12.SHIELD(SHELL) J13.2(RETURN) U2.10(GND) U3.3(SDO/SA0) U3.6(GND) U3.7(RES) U3.8(GND) U4.4(Addr) U4.5(GND) U12.6(VSS) U23.3 U23.8 U24.3 U24.8  [a separate net that carries the same name]
I2C2_SCL_BUS: R13.2 ; port I2C2_SCL_BUS
I2C2_SCL_BUS: R15.2 U3.1(SCL/SPC) U4.1(SCL)  [a separate net that carries the same name]
I2C2_SCL_U1: R15.1 ; port I2C2_SCL_U1
I2C2_SDA_BUS: R14.2 ; port I2C2_SDA_BUS
I2C2_SDA_BUS: R16.2 U3.4(SDA/SDI/SDO) U4.6(SDA)  [a separate net that carries the same name]
I2C2_SDA_U1: R16.1 ; port I2C2_SDA_U1
NOR_CLK_U1: R8.1 ; port NOR_CLK_U1
NOR_CLK_U2: R8.2 U2.16(CLK)
NOR_IO0_U1: R9.1 ; port NOR_IO0_U1
NOR_IO0_U2: R9.2 U2.15(DI_(IO0))
NOR_IO1_U1: R10.1 ; port NOR_IO1_U1
NOR_IO1_U2: R10.2 U2.8(DO_(IO1))
NOR_IO2_U1: R11.1 ; port NOR_IO2_U1
NOR_IO2_U2: R11.2 U2.9(/WP_(IO2))
NOR_IO3_U1: R12.1 ; port NOR_IO3_U1
NOR_IO3_U2: R12.2 U2.1(/HOLD_or_/RESET_(IO3))
NOR_NCS_U2: R7.2 ; port NOR_NCS_U2
NOR_NCS_U2: U2.7(/CS)  [a separate net that carries the same name]
SD_CK_CARD: J12.5(CLK) R79.2 U12.5(CLK) U23.5
SD_CK_U1: R79.1 ; port SD_CK_U1
SD_CMD_CARD: J12.3(CMD) R80.2 R85.2 U12.3(CMD) U23.4
SD_CMD_U1: R80.1 ; port SD_CMD_U1
SD_D0_CARD: J12.7(DAT0) R81.2 R86.2 U12.7(DAT0) U24.1
SD_D0_U1: R81.1 ; port SD_D0_U1
SD_D1_CARD: J12.8(DAT1) R82.2 R87.2 U12.8(DAT1) U24.2
SD_D1_U1: R82.1 ; port SD_D1_U1
SD_D2_CARD: J12.1(DAT2) R83.2 R88.2 U12.1(DAT2) U23.1
SD_D2_U1: R83.1 ; port SD_D2_U1
SD_D3_CARD: J12.2(CD/DAT3) R84.2 R89.2 U12.2(CD/DAT3) U23.2
SD_D3_U1: R84.1 ; port SD_D3_U1
SD_DET: C76.1 ; port SD_DET
SD_DET: J12.CD(CARD_DETECT) R90.2 U24.4  [a separate net that carries the same name]
TAMPER_IN_CONN: D9.1 J13.1(TAMPER) R99.2 R100.1
TAMPER_IN_U1: C78.1 ; port TAMPER_IN_U1
TAMPER_IN_U1: R100.2  [a separate net that carries the same name]

Not connected (* = marked no-connect by the designer): U2 4(N/C)* 5(N/C)* 6(N/C)* 11(N/C)* 12(N/C)* 13(N/C)* 14(N/C)*; U3 5(NC)* 11(INT2)*; U4 2(ALERT_/_INT)* EP(Exposed_pad)*; U23 6* 7* 9* 10*; U24 5* 6* 7* 9* 10*

### Notes on the sheet
- Every connected symbol pin has one explicit wire stub. Only hierarchical labels cross functional-sheet boundaries.
- 1
- 2
- 3
- 4
- 5
- 6
- 7
- 8
- 9
- 10
- 11
- A
- B
- C
- D
- E
- F
- G
- H
- Human-readable hierarchy candidate; exact Review-A pin/net equivalence enforced
- Functional sheet 9 of 10
- NOT FOR MANUFACTURE - hierarchy review/routing/DRC/DFM/Review B pending
- Title: Dioneya PCB-MAIN Rev.A - Storage + sensors
- File: PCB-MAIN_08_STORAGE_SENSORS.kicad_sch
- Sheet: /
- Dioneya / ZS-BPLA
- KiCad E.D.A.  kicad (5.1.4)-1
- Size: A2
- Date: 2026-09-16
- Rev: A
- Id: 1/1

### Library data of the parts
C21 = C21_GRM155R71E104KE14D: Manufacturer: Murata; Population: FITTED; Authority: Winbond_W25Q512JV_RevB; MPN: GRM155R71E104KE14D; Package: 0402; Value: 100 nF 25 V X7R; Footprint: Capacitor_SMD:C_0402_1005Metric
C22 = C22_GRM155R61C105KA12D: Manufacturer: Murata; Population: FITTED; Authority: Winbond_W25Q512JV_RevB; MPN: GRM155R61C105KA12D; Package: 0402; Value: 1 uF 16 V X5R; Footprint: Capacitor_SMD:C_0402_1005Metric
C23 = C23_GRM155R71E104KE14D: Manufacturer: Murata; Population: FITTED; Authority: ST_LIS2DW12_DS11811_Rev9; MPN: GRM155R71E104KE14D; Package: 0402; Value: 100 nF 25 V X7R; Footprint: Capacitor_SMD:C_0402_1005Metric
C24 = C24_GRM188R61A106KE69D: Manufacturer: Murata; Population: FITTED; Authority: ST_LIS2DW12_DS11811_Rev9; MPN: GRM188R61A106KE69D; Package: 0603; Value: 10 uF 10 V X5R; Footprint: Capacitor_SMD:C_0603_1608Metric
C25 = C25_GRM155R71E104KE14D: Manufacturer: Murata; Population: FITTED; Authority: ST_LIS2DW12_DS11811_Rev9; MPN: GRM155R71E104KE14D; Package: 0402; Value: 100 nF 25 V X7R; Footprint: Capacitor_SMD:C_0402_1005Metric
C26 = C26_GRM155R71E104KE14D: Manufacturer: Murata; Population: FITTED; Authority: ST_STTS22H_DS12606_Rev8; MPN: GRM155R71E104KE14D; Package: 0402; Value: 100 nF 25 V X7R; Footprint: Capacitor_SMD:C_0402_1005Metric
C74 = C74_GRM155R71E104KE14D: Manufacturer: Murata; Population: FITTED; Authority: SD_Association_microSD; MPN: GRM155R71E104KE14D; Package: 0402; Value: 100 nF 25 V X7R; Footprint: Capacitor_SMD:C_0402_1005Metric
C75 = C75_GRM188R61A106KE69D: Manufacturer: Murata; Population: FITTED; Authority: SD_Association_microSD; MPN: GRM188R61A106KE69D; Package: 0603; Value: 10 uF 10 V X5R; Footprint: Capacitor_SMD:C_0603_1608Metric
C76 = C76_GRM155R71E103KA01D: Manufacturer: Murata; Population: FITTED; Authority: GCT_MEM2052_official_product_data; MPN: GRM155R71E103KA01D; Package: 0402; Value: 10 nF 25 V X7R; Footprint: Capacitor_SMD:C_0402_1005Metric
C78 = C78_GRM155R71E103KA01D: Manufacturer: Murata; Population: FITTED; Authority: PROJECT_MAIN_AUTH_010; MPN: GRM155R71E103KA01D; Package: 0402; Value: 10 nF 25 V X7R; Footprint: Capacitor_SMD:C_0402_1005Metric
D9 = D9_TPD1E05U06DYAR: Manufacturer: Texas Instruments; Population: FITTED; Authority: TI_TPDxE05U06_RevO; MPN: TPD1E05U06DYAR; Package: SOD-523_DYA; Value: 5.5 V 0.5 pF ESD
D11 = D11_TPD1E05U06DYAR: Manufacturer: Texas Instruments; Population: FITTED; Authority: TI_TPDxE05U06_RevO; MPN: TPD1E05U06DYAR; Package: SOD-523_DYA; Value: 5.5 V 0.5 pF ESD
J12 = J12_MEM2052-00-195-00-A: Manufacturer: CONTROLLED_AUTHORITY; Population: FITTED; Authority: PCB_MAIN_CONNECTOR_FIXTURE_PIN_AUTHORITY_REV_A.csv; MPN: MEM2052-00-195-00-A; Package: microSD_push-push_1.95mm_8P_CD; Value: MEM2052-00-195-00-A
J13 = J13_504050-0291: Manufacturer: CONTROLLED_AUTHORITY; Population: FITTED; Authority: PCB_MAIN_CONNECTOR_FIXTURE_PIN_AUTHORITY_REV_A.csv; MPN: 504050-0291; Package: Pico-Lock_1.5mm_2P_RA_SMT; Value: 504050-0291
R7 = R7_ERJ-2RKF1002X: Manufacturer: Panasonic; Population: FITTED; Authority: Winbond_W25Q512JV_RevB; MPN: ERJ-2RKF1002X; Package: 0402; Value: 10 kOhm 1%; Footprint: Resistor_SMD:R_0402_1005Metric
R8 = R8_ERJ-2RKF22R0X: Manufacturer: Panasonic; Population: FITTED; Authority: PROJECT_MAIN_AUTH_010; MPN: ERJ-2RKF22R0X; Package: 0402; Value: 22 Ohm 1%; Footprint: Resistor_SMD:R_0402_1005Metric
R9 = R9_ERJ-2RKF22R0X: Manufacturer: Panasonic; Population: FITTED; Authority: PROJECT_MAIN_AUTH_010; MPN: ERJ-2RKF22R0X; Package: 0402; Value: 22 Ohm 1%; Footprint: Resistor_SMD:R_0402_1005Metric
R10 = R10_ERJ-2RKF22R0X: Manufacturer: Panasonic; Population: FITTED; Authority: PROJECT_MAIN_AUTH_010; MPN: ERJ-2RKF22R0X; Package: 0402; Value: 22 Ohm 1%; Footprint: Resistor_SMD:R_0402_1005Metric
R11 = R11_ERJ-2RKF22R0X: Manufacturer: Panasonic; Population: FITTED; Authority: PROJECT_MAIN_AUTH_010; MPN: ERJ-2RKF22R0X; Package: 0402; Value: 22 Ohm 1%; Footprint: Resistor_SMD:R_0402_1005Metric
R12 = R12_ERJ-2RKF22R0X: Manufacturer: Panasonic; Population: FITTED; Authority: PROJECT_MAIN_AUTH_010; MPN: ERJ-2RKF22R0X; Package: 0402; Value: 22 Ohm 1%; Footprint: Resistor_SMD:R_0402_1005Metric
R13 = R13_ERJ-2RKF2201X: Manufacturer: Panasonic; Population: FITTED; Authority: I2C_UM10204; MPN: ERJ-2RKF2201X; Package: 0402; Value: 2.2 kOhm 1%; Footprint: Resistor_SMD:R_0402_1005Metric
R14 = R14_ERJ-2RKF2201X: Manufacturer: Panasonic; Population: FITTED; Authority: I2C_UM10204; MPN: ERJ-2RKF2201X; Package: 0402; Value: 2.2 kOhm 1%; Footprint: Resistor_SMD:R_0402_1005Metric
R15 = R15_ERJ-2RKF22R0X: Manufacturer: Panasonic; Population: FITTED; Authority: PROJECT_MAIN_AUTH_010; MPN: ERJ-2RKF22R0X; Package: 0402; Value: 22 Ohm 1%; Footprint: Resistor_SMD:R_0402_1005Metric
R16 = R16_ERJ-2RKF22R0X: Manufacturer: Panasonic; Population: FITTED; Authority: PROJECT_MAIN_AUTH_010; MPN: ERJ-2RKF22R0X; Package: 0402; Value: 22 Ohm 1%; Footprint: Resistor_SMD:R_0402_1005Metric
R79 = R79_ERJ-2RKF22R0X: Manufacturer: Panasonic; Population: FITTED; Authority: SD_Association_microSD; MPN: ERJ-2RKF22R0X; Package: 0402; Value: 22 Ohm 1%; Footprint: Resistor_SMD:R_0402_1005Metric
R80 = R80_ERJ-2RKF22R0X: Manufacturer: Panasonic; Population: FITTED; Authority: SD_Association_microSD; MPN: ERJ-2RKF22R0X; Package: 0402; Value: 22 Ohm 1%; Footprint: Resistor_SMD:R_0402_1005Metric
R81 = R81_ERJ-2RKF22R0X: Manufacturer: Panasonic; Population: FITTED; Authority: SD_Association_microSD; MPN: ERJ-2RKF22R0X; Package: 0402; Value: 22 Ohm 1%; Footprint: Resistor_SMD:R_0402_1005Metric
R82 = R82_ERJ-2RKF22R0X: Manufacturer: Panasonic; Population: FITTED; Authority: SD_Association_microSD; MPN: ERJ-2RKF22R0X; Package: 0402; Value: 22 Ohm 1%; Footprint: Resistor_SMD:R_0402_1005Metric
R83 = R83_ERJ-2RKF22R0X: Manufacturer: Panasonic; Population: FITTED; Authority: SD_Association_microSD; MPN: ERJ-2RKF22R0X; Package: 0402; Value: 22 Ohm 1%; Footprint: Resistor_SMD:R_0402_1005Metric
R84 = R84_ERJ-2RKF22R0X: Manufacturer: Panasonic; Population: FITTED; Authority: SD_Association_microSD; MPN: ERJ-2RKF22R0X; Package: 0402; Value: 22 Ohm 1%; Footprint: Resistor_SMD:R_0402_1005Metric
R85 = R85_ERJ-2RKF1002X: Manufacturer: Panasonic; Population: FITTED; Authority: SD_Association_microSD; MPN: ERJ-2RKF1002X; Package: 0402; Value: 10 kOhm 1%; Footprint: Resistor_SMD:R_0402_1005Metric
R86 = R86_ERJ-2RKF1002X: Manufacturer: Panasonic; Population: FITTED; Authority: SD_Association_microSD; MPN: ERJ-2RKF1002X; Package: 0402; Value: 10 kOhm 1%; Footprint: Resistor_SMD:R_0402_1005Metric
R87 = R87_ERJ-2RKF1002X: Manufacturer: Panasonic; Population: FITTED; Authority: SD_Association_microSD; MPN: ERJ-2RKF1002X; Package: 0402; Value: 10 kOhm 1%; Footprint: Resistor_SMD:R_0402_1005Metric
R88 = R88_ERJ-2RKF1002X: Manufacturer: Panasonic; Population: FITTED; Authority: SD_Association_microSD; MPN: ERJ-2RKF1002X; Package: 0402; Value: 10 kOhm 1%; Footprint: Resistor_SMD:R_0402_1005Metric
R89 = R89_ERJ-2RKF1002X: Manufacturer: Panasonic; Population: FITTED; Authority: SD_Association_microSD; MPN: ERJ-2RKF1002X; Package: 0402; Value: 10 kOhm 1%; Footprint: Resistor_SMD:R_0402_1005Metric
R90 = R90_ERJ-2RKF1002X: Manufacturer: Panasonic; Population: FITTED; Authority: GCT_MEM2052_official_product_data; MPN: ERJ-2RKF1002X; Package: 0402; Value: 10 kOhm 1%; Footprint: Resistor_SMD:R_0402_1005Metric
R99 = R99_ERJ-2RKF1002X: Manufacturer: Panasonic; Population: FITTED; Authority: PROJECT_MAIN_AUTH_010; MPN: ERJ-2RKF1002X; Package: 0402; Value: 10 kOhm 1%; Footprint: Resistor_SMD:R_0402_1005Metric
R100 = R100_ERJ-2RKF1001X: Manufacturer: Panasonic; Population: FITTED; Authority: PROJECT_MAIN_AUTH_010; MPN: ERJ-2RKF1001X; Package: 0402; Value: 1 kOhm 1%; Footprint: Resistor_SMD:R_0402_1005Metric
U2 = U2_W25Q512JVFIQ: Manufacturer: Winbond; Population: FITTED; Authority: PCB_MAIN_STORAGE_SENSOR_PIN_AUTHORITY_REV_A.csv; MPN: W25Q512JVFIQ; Package: SOIC-16_300mil_F; Value: W25Q512JVFIQ
U3 = U3_LIS2DW12TR: Manufacturer: STMicroelectronics; Population: FITTED; Authority: PCB_MAIN_STORAGE_SENSOR_PIN_AUTHORITY_REV_A.csv; MPN: LIS2DW12TR; Package: LGA-12_2x2mm; Value: LIS2DW12TR
U4 = U4_STTS22HTR: Manufacturer: STMicroelectronics; Population: FITTED; Authority: PCB_MAIN_STORAGE_SENSOR_PIN_AUTHORITY_REV_A.csv; MPN: STTS22HTR; Package: UDFN-6L_2x2mm; Value: STTS22HTR
U12 = U12_SDCIT2_32GB: Manufacturer: Kingston; Population: FITTED; Authority: PCB_MAIN_CONNECTOR_FIXTURE_PIN_AUTHORITY_REV_A.csv; MPN: SDCIT2/32GB; Package: microSD_card_8_contact; Value: SDCIT2/32GB
U23 = U23_TPD4E05U06DQAR: Manufacturer: Texas Instruments; Population: FITTED; Authority: TI_TPDxE05U06_RevO; MPN: TPD4E05U06DQAR; Package: USON-10_DQA; Value: 4 channel 0.5 pF ESD
U24 = U24_TPD4E05U06DQAR: Manufacturer: Texas Instruments; Population: FITTED; Authority: TI_TPDxE05U06_RevO; MPN: TPD4E05U06DQAR; Package: USON-10_DQA; Value: 4 channel 0.5 pF ESD

## Sheet PCB-MAIN_09_CONNECTORS_TEST.SchDoc
size 594 x 420 mm
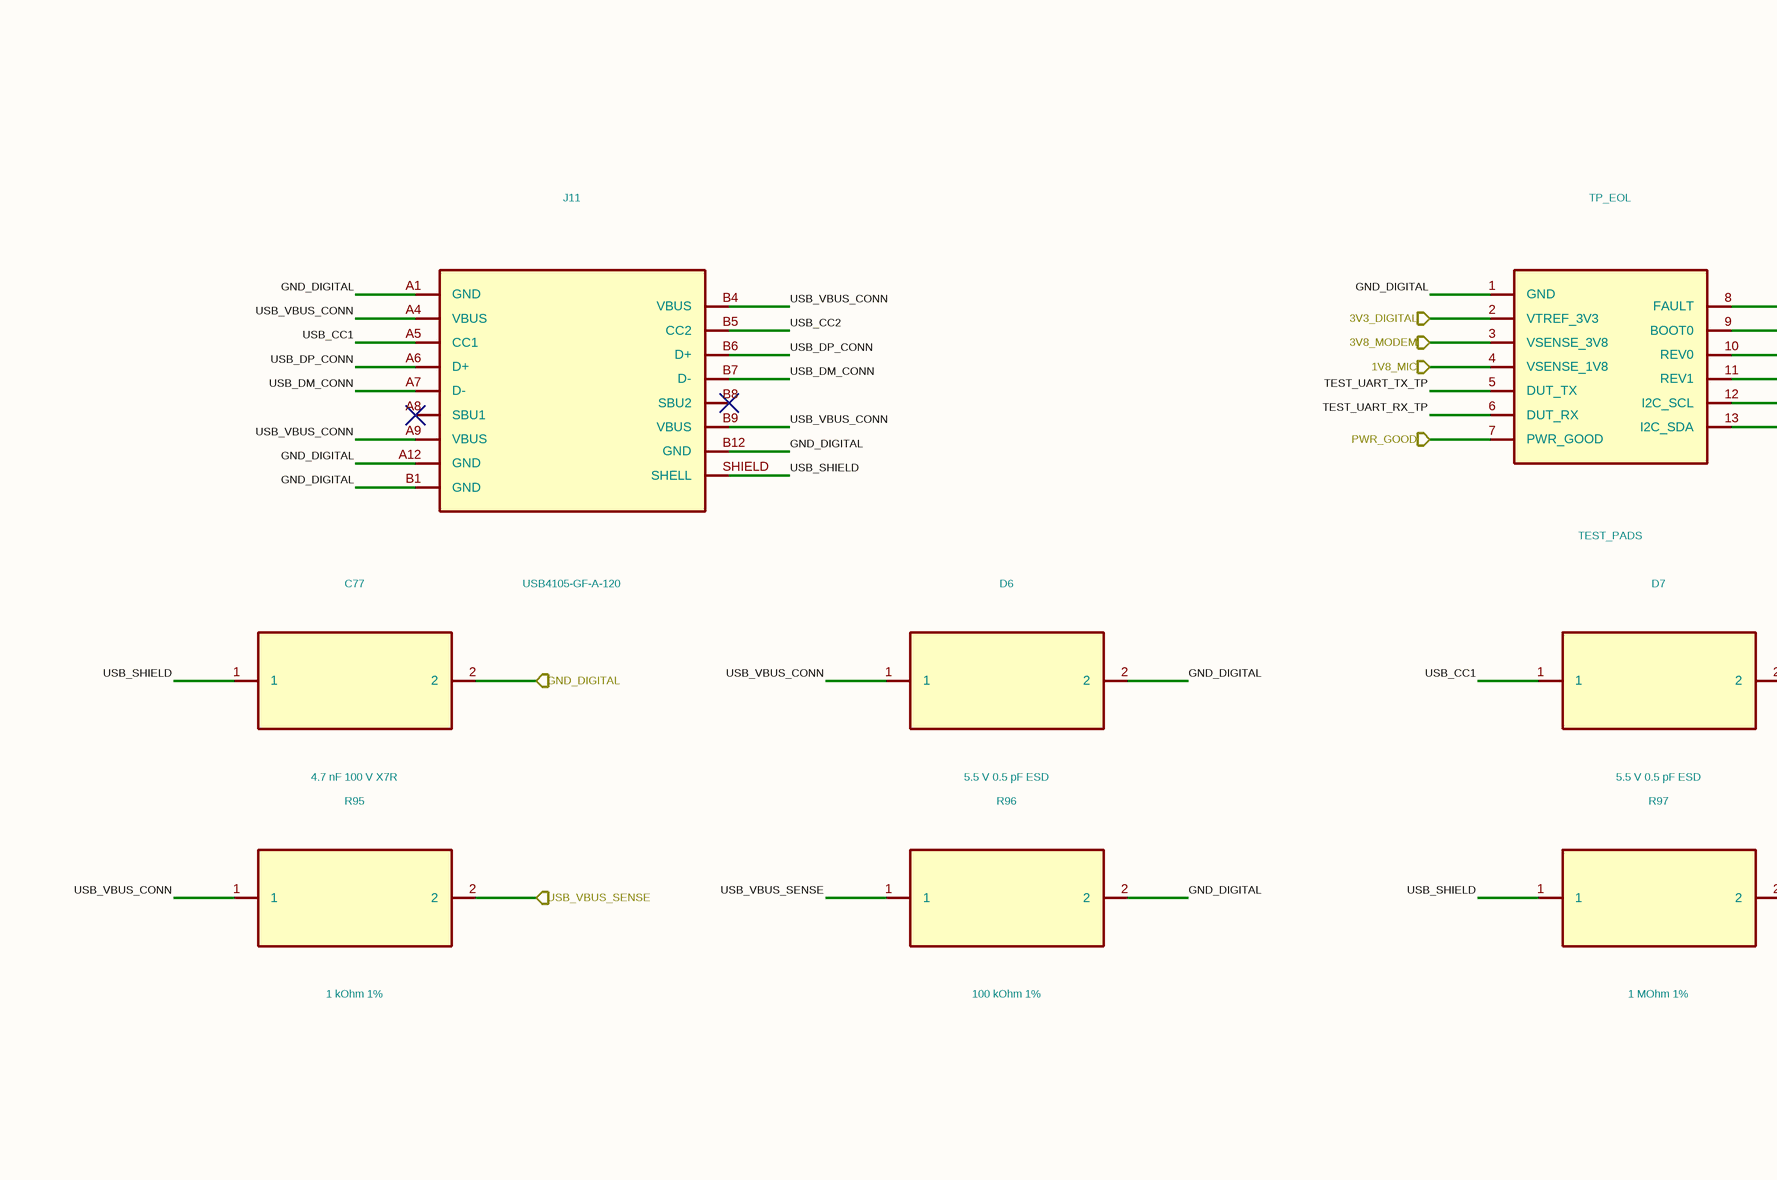
[diagram p56: PCB-MAIN_09_CONNECTORS_TEST.SchDoc, top left]
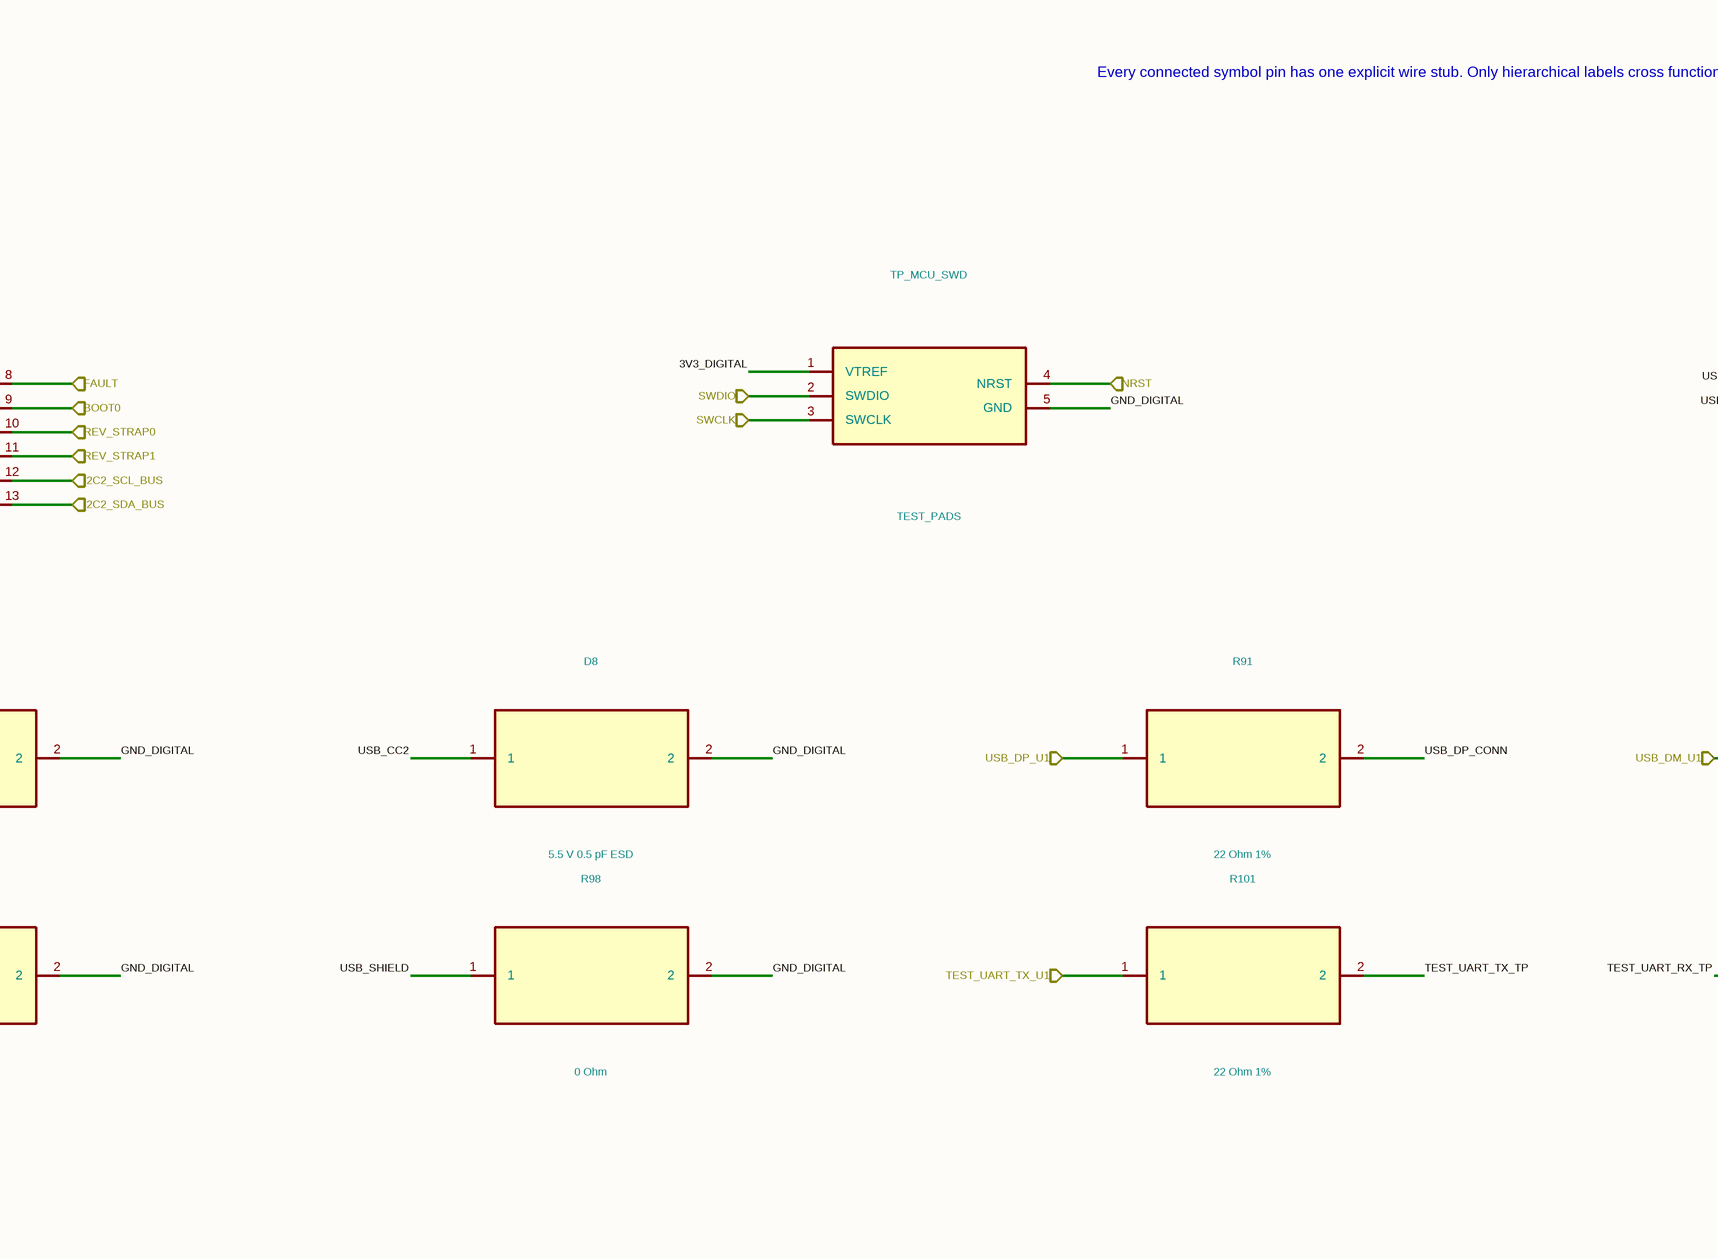
[diagram p57: PCB-MAIN_09_CONNECTORS_TEST.SchDoc, top middle]
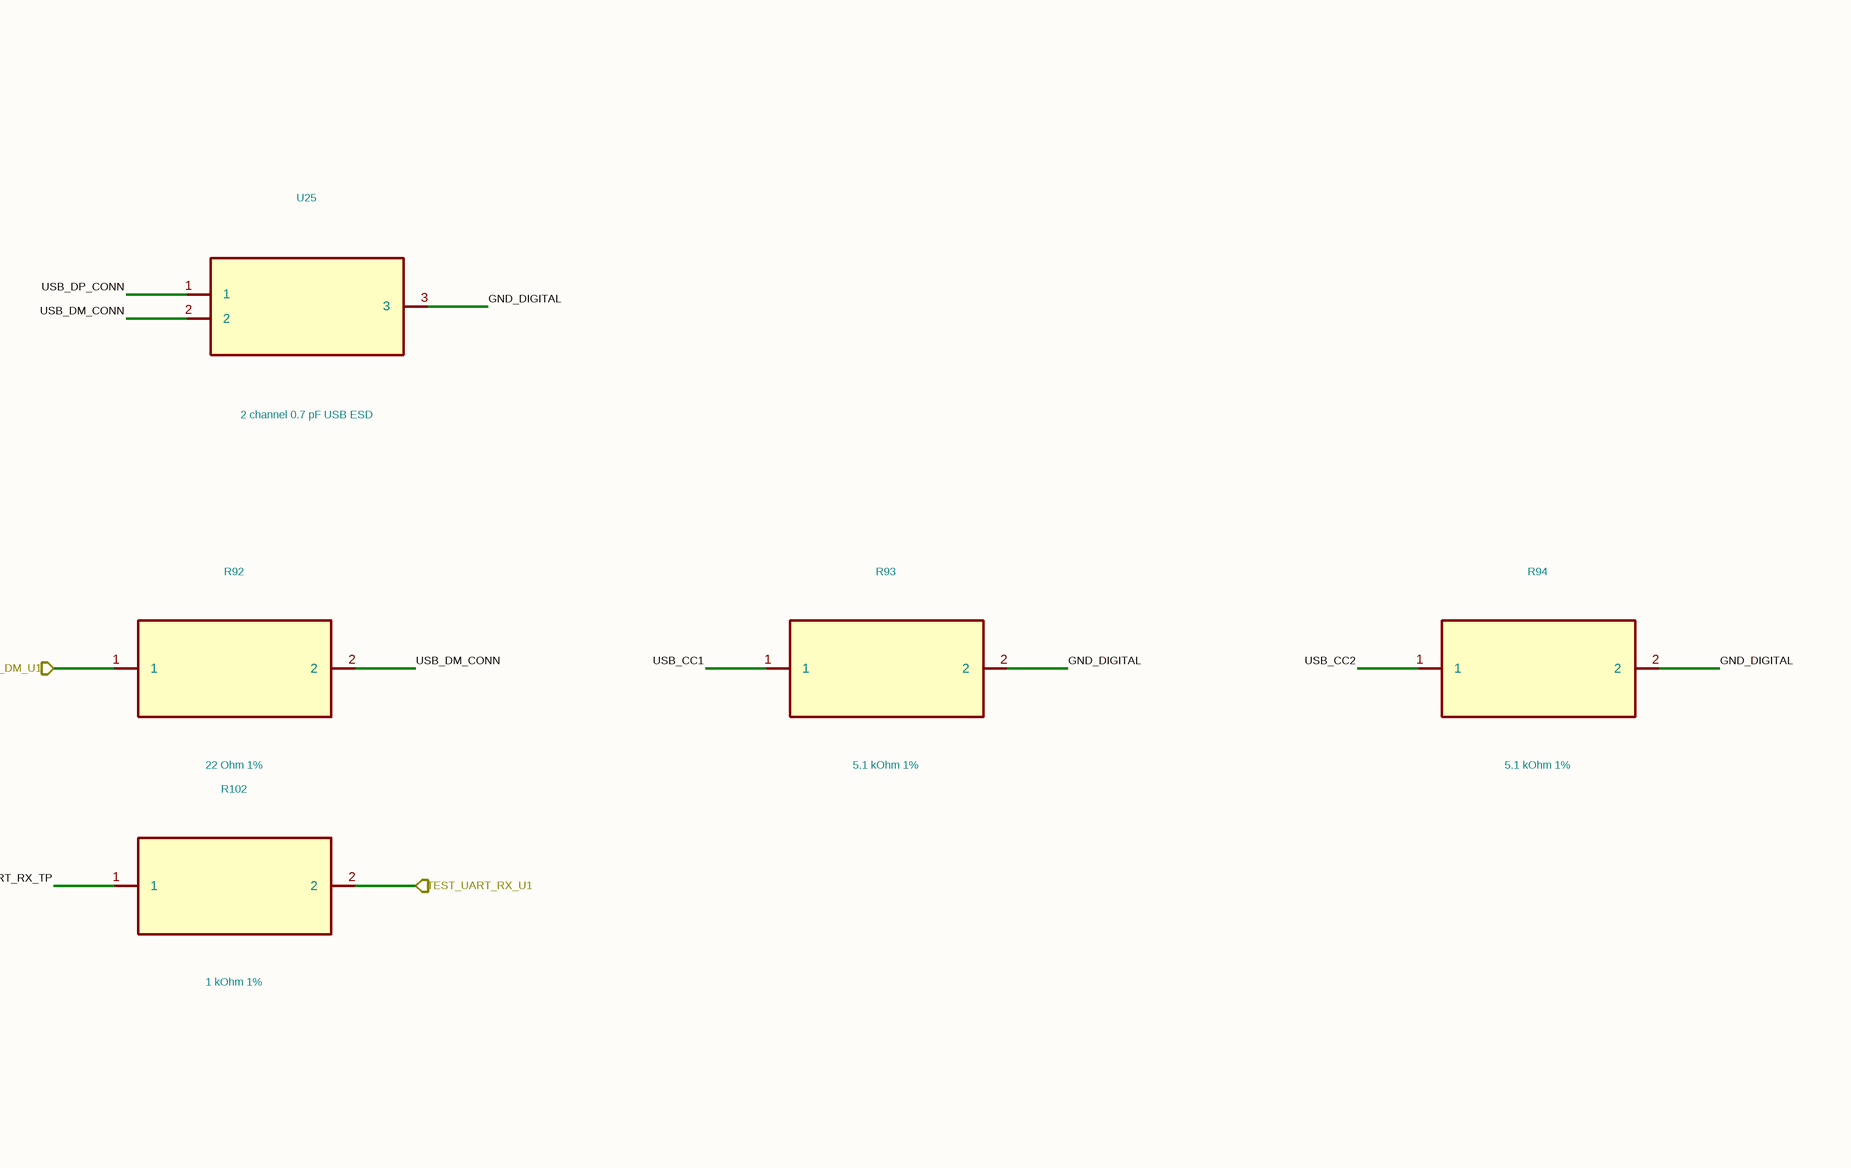
[diagram p58: PCB-MAIN_09_CONNECTORS_TEST.SchDoc, top right]
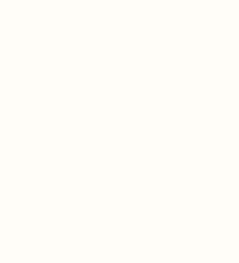
[diagram p59: PCB-MAIN_09_CONNECTORS_TEST.SchDoc, bottom left]

### Parts
C77  4.7 nF 100 V X7R  [C_0402_1005Metric]
D6  5.5 V 0.5 pF ESD
D7  5.5 V 0.5 pF ESD
D8  5.5 V 0.5 pF ESD
J11  USB4105-GF-A-120
R91  22 Ohm 1%  [R_0402_1005Metric]
R92  22 Ohm 1%  [R_0402_1005Metric]
R93  5.1 kOhm 1%  [R_0402_1005Metric]
R94  5.1 kOhm 1%  [R_0402_1005Metric]
R95  1 kOhm 1%  [R_0402_1005Metric]
R96  100 kOhm 1%  [R_0402_1005Metric]
R97  1 MOhm 1%  [R_0402_1005Metric]
R98  0 Ohm  [R_0402_1005Metric]
R101  22 Ohm 1%  [R_0402_1005Metric]
R102  1 kOhm 1%  [R_0402_1005Metric]
TP_EOL  TEST_PADS
TP_MCU_SWD  TEST_PADS
U25  2 channel 0.7 pF USB ESD

### Ports
1V8_MIC, 3V3_DIGITAL, 3V8_MODEM, BOOT0, FAULT, GND_DIGITAL, I2C2_SCL_BUS, I2C2_SDA_BUS, NRST, PWR_GOOD, REV_STRAP0, REV_STRAP1, SWCLK, SWDIO, TEST_UART_RX_U1, TEST_UART_TX_U1, USB_DM_U1, USB_DP_U1, USB_VBUS_SENSE

### Nets
1V8_MIC: TP_EOL.4(VSENSE_1V8) ; port 1V8_MIC
3V3_DIGITAL: TP_EOL.2(VTREF_3V3) ; port 3V3_DIGITAL
3V3_DIGITAL: TP_MCU_SWD.1(VTREF)  [a separate net that carries the same name]
3V8_MODEM: TP_EOL.3(VSENSE_3V8) ; port 3V8_MODEM
BOOT0: TP_EOL.9(BOOT0) ; port BOOT0
FAULT: TP_EOL.8(FAULT) ; port FAULT
GND_DIGITAL: C77.2 ; port GND_DIGITAL
GND_DIGITAL: D6.2 D7.2 D8.2 J11.A1(GND) J11.A12(GND) J11.B1(GND) J11.B12(GND) R93.2 R94.2 R96.2 R97.2 R98.2 TP_EOL.1(GND) TP_MCU_SWD.5(GND) U25.3  [a separate net that carries the same name]
I2C2_SCL_BUS: TP_EOL.12(I2C_SCL) ; port I2C2_SCL_BUS
I2C2_SDA_BUS: TP_EOL.13(I2C_SDA) ; port I2C2_SDA_BUS
NRST: TP_MCU_SWD.4(NRST) ; port NRST
PWR_GOOD: TP_EOL.7(PWR_GOOD) ; port PWR_GOOD
REV_STRAP0: TP_EOL.10(REV0) ; port REV_STRAP0
REV_STRAP1: TP_EOL.11(REV1) ; port REV_STRAP1
SWCLK: TP_MCU_SWD.3(SWCLK) ; port SWCLK
SWDIO: TP_MCU_SWD.2(SWDIO) ; port SWDIO
TEST_UART_RX_TP: R102.1 TP_EOL.6(DUT_RX)
TEST_UART_RX_U1: R102.2 ; port TEST_UART_RX_U1
TEST_UART_TX_TP: R101.2 TP_EOL.5(DUT_TX)
TEST_UART_TX_U1: R101.1 ; port TEST_UART_TX_U1
USB_CC1: D7.1 J11.A5(CC1) R93.1
USB_CC2: D8.1 J11.B5(CC2) R94.1
USB_DM_CONN: J11.A7(D-) J11.B7(D-) R92.2 U25.2
USB_DM_U1: R92.1 ; port USB_DM_U1
USB_DP_CONN: J11.A6(D+) J11.B6(D+) R91.2 U25.1
USB_DP_U1: R91.1 ; port USB_DP_U1
USB_SHIELD: C77.1 J11.SHIELD(SHELL) R97.1 R98.1
USB_VBUS_CONN: D6.1 J11.A4(VBUS) J11.A9(VBUS) J11.B4(VBUS) J11.B9(VBUS) R95.1
USB_VBUS_SENSE: R95.2 ; port USB_VBUS_SENSE
USB_VBUS_SENSE: R96.1  [a separate net that carries the same name]

Not connected (* = marked no-connect by the designer): J11 A8(SBU1)* B8(SBU2)*

### Notes on the sheet
- Every connected symbol pin has one explicit wire stub. Only hierarchical labels cross functional-sheet boundaries.
- 1
- 2
- 3
- 4
- 5
- 6
- 7
- 8
- 9
- 10
- 11
- A
- B
- C
- D
- E
- F
- G
- H
- Human-readable hierarchy candidate; exact Review-A pin/net equivalence enforced
- Functional sheet 10 of 10
- NOT FOR MANUFACTURE - hierarchy review/routing/DRC/DFM/Review B pending
- Title: Dioneya PCB-MAIN Rev.A - USB + debug
- File: PCB-MAIN_09_CONNECTORS_TEST.kicad_sch
- Sheet: /
- Dioneya / ZS-BPLA
- KiCad E.D.A.  kicad (5.1.4)-1
- Size: A2
- Date: 2026-09-16
- Rev: A
- Id: 1/1

### Library data of the parts
C77 = C77_GRM155R72A472KA01D: Manufacturer: Murata; Population: FITTED; Authority: PROJECT_EMC_BASELINE; MPN: GRM155R72A472KA01D; Package: 0402; Value: 4.7 nF 100 V X7R; Footprint: Capacitor_SMD:C_0402_1005Metric
D6 = D6_TPD1E05U06DYAR: Manufacturer: Texas Instruments; Population: FITTED; Authority: TI_TPDxE05U06_RevO; MPN: TPD1E05U06DYAR; Package: SOD-523_DYA; Value: 5.5 V 0.5 pF ESD
D7 = D7_TPD1E05U06DYAR: Manufacturer: Texas Instruments; Population: FITTED; Authority: TI_TPDxE05U06_RevO; MPN: TPD1E05U06DYAR; Package: SOD-523_DYA; Value: 5.5 V 0.5 pF ESD
D8 = D8_TPD1E05U06DYAR: Manufacturer: Texas Instruments; Population: FITTED; Authority: TI_TPDxE05U06_RevO; MPN: TPD1E05U06DYAR; Package: SOD-523_DYA; Value: 5.5 V 0.5 pF ESD
J11 = J11_USB4105-GF-A-120: Manufacturer: CONTROLLED_AUTHORITY; Population: FITTED; Authority: PCB_MAIN_CONNECTOR_FIXTURE_PIN_AUTHORITY_REV_A.csv; MPN: USB4105-GF-A-120; Package: USB-C_16P_horizontal_top_mount_1.20mm_stake; Value: USB4105-GF-A-120
R91 = R91_ERJ-2RKF22R0X: Manufacturer: Panasonic; Population: FITTED; Authority: ST_STM32U585_DS13086_Rev10; MPN: ERJ-2RKF22R0X; Package: 0402; Value: 22 Ohm 1%; Footprint: Resistor_SMD:R_0402_1005Metric
R92 = R92_ERJ-2RKF22R0X: Manufacturer: Panasonic; Population: FITTED; Authority: ST_STM32U585_DS13086_Rev10; MPN: ERJ-2RKF22R0X; Package: 0402; Value: 22 Ohm 1%; Footprint: Resistor_SMD:R_0402_1005Metric
R93 = R93_ERJ-2RKF5101X: Manufacturer: Panasonic; Population: FITTED; Authority: USB_Type-C_Release_2.5; MPN: ERJ-2RKF5101X; Package: 0402; Value: 5.1 kOhm 1%; Footprint: Resistor_SMD:R_0402_1005Metric
R94 = R94_ERJ-2RKF5101X: Manufacturer: Panasonic; Population: FITTED; Authority: USB_Type-C_Release_2.5; MPN: ERJ-2RKF5101X; Package: 0402; Value: 5.1 kOhm 1%; Footprint: Resistor_SMD:R_0402_1005Metric
R95 = R95_ERJ-2RKF1001X: Manufacturer: Panasonic; Population: FITTED; Authority: ST_STM32U585_DS13086_Rev10; MPN: ERJ-2RKF1001X; Package: 0402; Value: 1 kOhm 1%; Footprint: Resistor_SMD:R_0402_1005Metric
R96 = R96_ERJ-2RKF1003X: Manufacturer: Panasonic; Population: FITTED; Authority: PROJECT_MAIN_AUTH_010; MPN: ERJ-2RKF1003X; Package: 0402; Value: 100 kOhm 1%; Footprint: Resistor_SMD:R_0402_1005Metric
R97 = R97_ERJ-2RKF1004X: Manufacturer: Panasonic; Population: FITTED; Authority: PROJECT_EMC_BASELINE; MPN: ERJ-2RKF1004X; Package: 0402; Value: 1 MOhm 1%; Footprint: Resistor_SMD:R_0402_1005Metric
R98 = R98_ERJ-2GE0R00X: Manufacturer: Panasonic; Population: DNP; Authority: PROJECT_EMC_BASELINE; MPN: ERJ-2GE0R00X; Package: 0402; Value: 0 Ohm; Footprint: Resistor_SMD:R_0402_1005Metric
R101 = R101_ERJ-2RKF22R0X: Manufacturer: Panasonic; Population: FITTED; Authority: PROJECT_EOL_DFT; MPN: ERJ-2RKF22R0X; Package: 0402; Value: 22 Ohm 1%; Footprint: Resistor_SMD:R_0402_1005Metric
R102 = R102_ERJ-2RKF1001X: Manufacturer: Panasonic; Population: FITTED; Authority: PROJECT_EOL_DFT; MPN: ERJ-2RKF1001X; Package: 0402; Value: 1 kOhm 1%; Footprint: Resistor_SMD:R_0402_1005Metric
TP_EOL = TP_EOL_TEST_PADS: Manufacturer: CONTROLLED_AUTHORITY; Population: FITTED; Authority: PCB_MAIN_CONNECTOR_FIXTURE_PIN_AUTHORITY_REV_A.csv; MPN: TEST_PADS; Package: POGO_FIXTURE_13P; Value: TEST_PADS
TP_MCU_SWD = TP_MCU_SWD_TEST_PADS: Manufacturer: CONTROLLED_AUTHORITY; Population: FITTED; Authority: PCB_MAIN_CONNECTOR_FIXTURE_PIN_AUTHORITY_REV_A.csv; MPN: TEST_PADS; Package: POGO_FIXTURE_5P; Value: TEST_PADS
U25 = U25_TPD2EUSB30DRTR: Manufacturer: Texas Instruments; Population: FITTED; Authority: TI_TPD2EUSB30_datasheet; MPN: TPD2EUSB30DRTR; Package: SOT-9X3_DRT; Value: 2 channel 0.7 pF USB ESD

## Nets that join several sheets
1V8_MIC: PCB-MAIN_01_POWER (C20.1), PCB-MAIN_03_AUDIO (C27.1), PCB-MAIN_09_CONNECTORS_TEST (TP_EOL.4)
3V3_DIGITAL: PCB-MAIN_01_POWER (C19.1), PCB-MAIN_02_MCU (C1.1), PCB-MAIN_03_AUDIO (C28.1), PCB-MAIN_04_GNSS (C60.1), PCB-MAIN_05_CELLULAR (C34.1), PCB-MAIN_06_LORA (C66.1), PCB-MAIN_07_BLE (C71.1), PCB-MAIN_08_STORAGE_SENSORS (C21.1), PCB-MAIN_09_CONNECTORS_TEST (TP_EOL.2)
3V8_MODEM: PCB-MAIN_01_POWER (J_PWR.1), PCB-MAIN_05_CELLULAR (FB1.1), PCB-MAIN_09_CONNECTORS_TEST (TP_EOL.3)
AAD_CFG: PCB-MAIN_02_MCU (U1.77), PCB-MAIN_03_AUDIO (U7.16)
ACCEL_INT: PCB-MAIN_02_MCU (U1.63), PCB-MAIN_08_STORAGE_SENSORS (U3.12)
BLE_DFU_REQ: PCB-MAIN_02_MCU (U1.34), PCB-MAIN_07_BLE (R76.2)
BLE_EN: PCB-MAIN_02_MCU (U1.5), PCB-MAIN_07_BLE (R77.1)
BLE_RX_U1: PCB-MAIN_02_MCU (U1.45), PCB-MAIN_07_BLE (R74.2)
BLE_TX_U1: PCB-MAIN_02_MCU (U1.44), PCB-MAIN_07_BLE (R75.1)
BOOT0: PCB-MAIN_02_MCU (R2.1), PCB-MAIN_09_CONNECTORS_TEST (TP_EOL.9)
CELL_DTR_U16: PCB-MAIN_02_MCU (U1.61), PCB-MAIN_05_CELLULAR (R29.1)
CELL_PWRKEY_CMD: PCB-MAIN_02_MCU (U1.58), PCB-MAIN_05_CELLULAR (R24.1)
CELL_RESET_N_CMD: PCB-MAIN_02_MCU (U1.59), PCB-MAIN_05_CELLULAR (R26.1)
CELL_RI_U16: PCB-MAIN_02_MCU (U1.62), PCB-MAIN_05_CELLULAR (R33.2)
CELL_RX_U16: PCB-MAIN_02_MCU (U1.93), PCB-MAIN_05_CELLULAR (R32.2)
CELL_STATUS_U16: PCB-MAIN_02_MCU (U1.60), PCB-MAIN_05_CELLULAR (R34.1)
CELL_TX_U16: PCB-MAIN_02_MCU (U1.92), PCB-MAIN_05_CELLULAR (R28.2)
EN_AUX: PCB-MAIN_01_POWER (J_PWR.10), PCB-MAIN_02_MCU (U1.86)
EN_MODEM: PCB-MAIN_01_POWER (J_PWR.9), PCB-MAIN_02_MCU (U1.85)
FAULT: PCB-MAIN_01_POWER (J_PWR.8), PCB-MAIN_09_CONNECTORS_TEST (TP_EOL.8)
GND_DIGITAL: PCB-MAIN_01_POWER (C19.2), PCB-MAIN_02_MCU (C1.2), PCB-MAIN_03_AUDIO (C27.2), PCB-MAIN_04_GNSS (C60.2), PCB-MAIN_06_LORA (C66.2), PCB-MAIN_07_BLE (C71.2), PCB-MAIN_08_STORAGE_SENSORS (C21.2), PCB-MAIN_09_CONNECTORS_TEST (C77.2)
GND_MIC: PCB-MAIN_01_POWER (C20.2), PCB-MAIN_03_AUDIO (C30.2)
GND_MODEM: PCB-MAIN_01_POWER (J_PWR.2), PCB-MAIN_05_CELLULAR (C33.2)
GNSS_PPS_U1: PCB-MAIN_02_MCU (U1.22), PCB-MAIN_04_GNSS (R58.2)
GNSS_RX_U1: PCB-MAIN_02_MCU (U1.25), PCB-MAIN_04_GNSS (R56.2)
GNSS_TX_U1: PCB-MAIN_02_MCU (U1.24), PCB-MAIN_04_GNSS (R57.1)
I2C2_SCL_BUS: PCB-MAIN_01_POWER (J_PWR.11), PCB-MAIN_08_STORAGE_SENSORS (R13.2), PCB-MAIN_09_CONNECTORS_TEST (TP_EOL.12)
I2C2_SCL_U1: PCB-MAIN_02_MCU (U1.52), PCB-MAIN_08_STORAGE_SENSORS (R15.1)
I2C2_SDA_BUS: PCB-MAIN_01_POWER (J_PWR.12), PCB-MAIN_08_STORAGE_SENSORS (R14.2), PCB-MAIN_09_CONNECTORS_TEST (TP_EOL.13)
I2C2_SDA_U1: PCB-MAIN_02_MCU (U1.53), PCB-MAIN_08_STORAGE_SENSORS (R16.1)
LORA_BUSY: PCB-MAIN_02_MCU (U1.56), PCB-MAIN_06_LORA (R66.1)
LORA_DIO1: PCB-MAIN_02_MCU (U1.17), PCB-MAIN_06_LORA (R65.1)
LORA_MISO_U1: PCB-MAIN_02_MCU (U1.30), PCB-MAIN_06_LORA (R72.2)
LORA_MOSI_U1: PCB-MAIN_02_MCU (U1.31), PCB-MAIN_06_LORA (R71.1)
LORA_NSS_U1: PCB-MAIN_02_MCU (U1.28), PCB-MAIN_06_LORA (R69.1)
LORA_RESET_N: PCB-MAIN_02_MCU (U1.57), PCB-MAIN_06_LORA (C68.1)
LORA_RXEN: PCB-MAIN_02_MCU (U1.55), PCB-MAIN_06_LORA (R64.1)
LORA_SCK_U1: PCB-MAIN_02_MCU (U1.29), PCB-MAIN_06_LORA (R70.1)
LORA_TXEN: PCB-MAIN_02_MCU (U1.54), PCB-MAIN_06_LORA (R63.1)
MIC_WAKE: PCB-MAIN_02_MCU (U1.67), PCB-MAIN_03_AUDIO (R23.1)
NOR_CLK_U1: PCB-MAIN_02_MCU (U1.38), PCB-MAIN_08_STORAGE_SENSORS (R8.1)
NOR_IO0_U1: PCB-MAIN_02_MCU (U1.40), PCB-MAIN_08_STORAGE_SENSORS (R9.1)
NOR_IO1_U1: PCB-MAIN_02_MCU (U1.41), PCB-MAIN_08_STORAGE_SENSORS (R10.1)
NOR_IO2_U1: PCB-MAIN_02_MCU (U1.42), PCB-MAIN_08_STORAGE_SENSORS (R11.1)
NOR_IO3_U1: PCB-MAIN_02_MCU (U1.43), PCB-MAIN_08_STORAGE_SENSORS (R12.1)
NOR_NCS_U2: PCB-MAIN_02_MCU (U1.39), PCB-MAIN_08_STORAGE_SENSORS (R7.2)
NRST: PCB-MAIN_02_MCU (C18.1), PCB-MAIN_09_CONNECTORS_TEST (TP_MCU_SWD.4)
PDM_CLK: PCB-MAIN_02_MCU (U1.37), PCB-MAIN_03_AUDIO (U7.17)
PDM_DATA1: PCB-MAIN_02_MCU (U1.33), PCB-MAIN_03_AUDIO (U7.21)
PDM_DATA2: PCB-MAIN_02_MCU (U1.87), PCB-MAIN_03_AUDIO (U7.20)
PDM_DATA3: PCB-MAIN_02_MCU (U1.35), PCB-MAIN_03_AUDIO (U7.19)
PDM_DATA4: PCB-MAIN_02_MCU (U1.3), PCB-MAIN_03_AUDIO (U7.18)
PWR_FAULT: PCB-MAIN_01_POWER (R103.2), PCB-MAIN_02_MCU (U1.82)
PWR_GOOD: PCB-MAIN_01_POWER (J_PWR.7), PCB-MAIN_02_MCU (U1.81), PCB-MAIN_09_CONNECTORS_TEST (TP_EOL.7)
REV_STRAP0: PCB-MAIN_02_MCU (U1.95), PCB-MAIN_09_CONNECTORS_TEST (TP_EOL.10)
REV_STRAP1: PCB-MAIN_02_MCU (U1.96), PCB-MAIN_09_CONNECTORS_TEST (TP_EOL.11)
SD_CK_U1: PCB-MAIN_02_MCU (U1.80), PCB-MAIN_08_STORAGE_SENSORS (R79.1)
SD_CMD_U1: PCB-MAIN_02_MCU (U1.83), PCB-MAIN_08_STORAGE_SENSORS (R80.1)
SD_D0_U1: PCB-MAIN_02_MCU (U1.65), PCB-MAIN_08_STORAGE_SENSORS (R81.1)
SD_D1_U1: PCB-MAIN_02_MCU (U1.66), PCB-MAIN_08_STORAGE_SENSORS (R82.1)
SD_D2_U1: PCB-MAIN_02_MCU (U1.78), PCB-MAIN_08_STORAGE_SENSORS (R83.1)
SD_D3_U1: PCB-MAIN_02_MCU (U1.79), PCB-MAIN_08_STORAGE_SENSORS (R84.1)
SD_DET: PCB-MAIN_02_MCU (U1.7), PCB-MAIN_08_STORAGE_SENSORS (C76.1)
SIM1_DET: PCB-MAIN_02_MCU (U1.2), PCB-MAIN_05_CELLULAR (C52.1)
SIM2_DET: PCB-MAIN_02_MCU (U1.4), PCB-MAIN_05_CELLULAR (C53.1)
SIM_MUX_EN: PCB-MAIN_02_MCU (U1.1), PCB-MAIN_05_CELLULAR (R46.1)
SIM_MUX_SEL: PCB-MAIN_02_MCU (U1.97), PCB-MAIN_05_CELLULAR (R45.1)
SWCLK: PCB-MAIN_02_MCU (U1.76), PCB-MAIN_09_CONNECTORS_TEST (TP_MCU_SWD.3)
SWDIO: PCB-MAIN_02_MCU (U1.72), PCB-MAIN_09_CONNECTORS_TEST (TP_MCU_SWD.2)
TAMPER_IN_U1: PCB-MAIN_02_MCU (U1.64), PCB-MAIN_08_STORAGE_SENSORS (C78.1)
TEST_UART_RX_U1: PCB-MAIN_02_MCU (U1.15), PCB-MAIN_09_CONNECTORS_TEST (R102.2)
TEST_UART_TX_U1: PCB-MAIN_02_MCU (U1.16), PCB-MAIN_09_CONNECTORS_TEST (R101.1)
USB_DM_U1: PCB-MAIN_02_MCU (U1.70), PCB-MAIN_09_CONNECTORS_TEST (R92.1)
USB_DP_U1: PCB-MAIN_02_MCU (U1.71), PCB-MAIN_09_CONNECTORS_TEST (R91.1)
USB_VBUS_SENSE: PCB-MAIN_02_MCU (U1.68), PCB-MAIN_09_CONNECTORS_TEST (R95.2)